# Altium project Studio_Clock_hv1.PrjPcb (part 1 of 3)
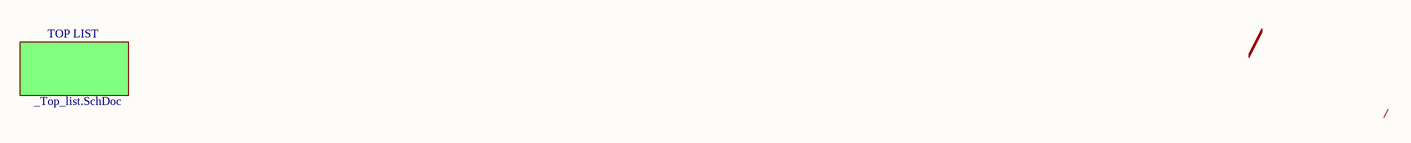
[diagram p0: Title.SchDoc]
PJ_Name: Studio Clock; PJ_Revision: V1.00
16 sheets, 343 parts. Net scope: flat (ports and power ports of the same name join across sheets).
Sheets:
  Title.SchDoc
    TOP LIST = _TOP_List.SchDoc
      Q_LIGHT_CTRL1 = Q_Light_CTRL1.SchDoc
      SWITCH = SWITCH_CTRL1.SchDoc
      MP_CTRL1 = MP_CTRL1.SchDoc
      CLOCK DISPLAY = CLOCK_Display.SchDoc
        AM_PM_INDICATOR = AM_PM_Indicator.SchDoc
        7 SEGMENT DISPLAY = Clock_7Segment.SchDoc
      VIDEO INTERFACE = VIDEO_Interface.SchDoc
      POE = POE.SchDoc
        POE_PSU = POE_PSU.SchDoc
        POE_PD1 = POE_PD.SchDoc
        PD_BUCK1 = PD Buck.SchDoc
      POWER SUPPLY = POWER_Supply.SchDoc
        BACKUP Power = BACKUP_Power.SchDoc
      RTC = RTC.SchDoc

## Sheet Title.SchDoc: =PJ_Name
size A4; SheetNumber: 1; SheetTotal: 16

### Sub-sheets
TOP LIST = _Top_list.SchDoc: no entries

### Notes on the sheet
- /

## Sheet _TOP_List.SchDoc: Studio Clock
size A4; Revision: V1.00; SheetNumber: 2; SheetTotal: 16
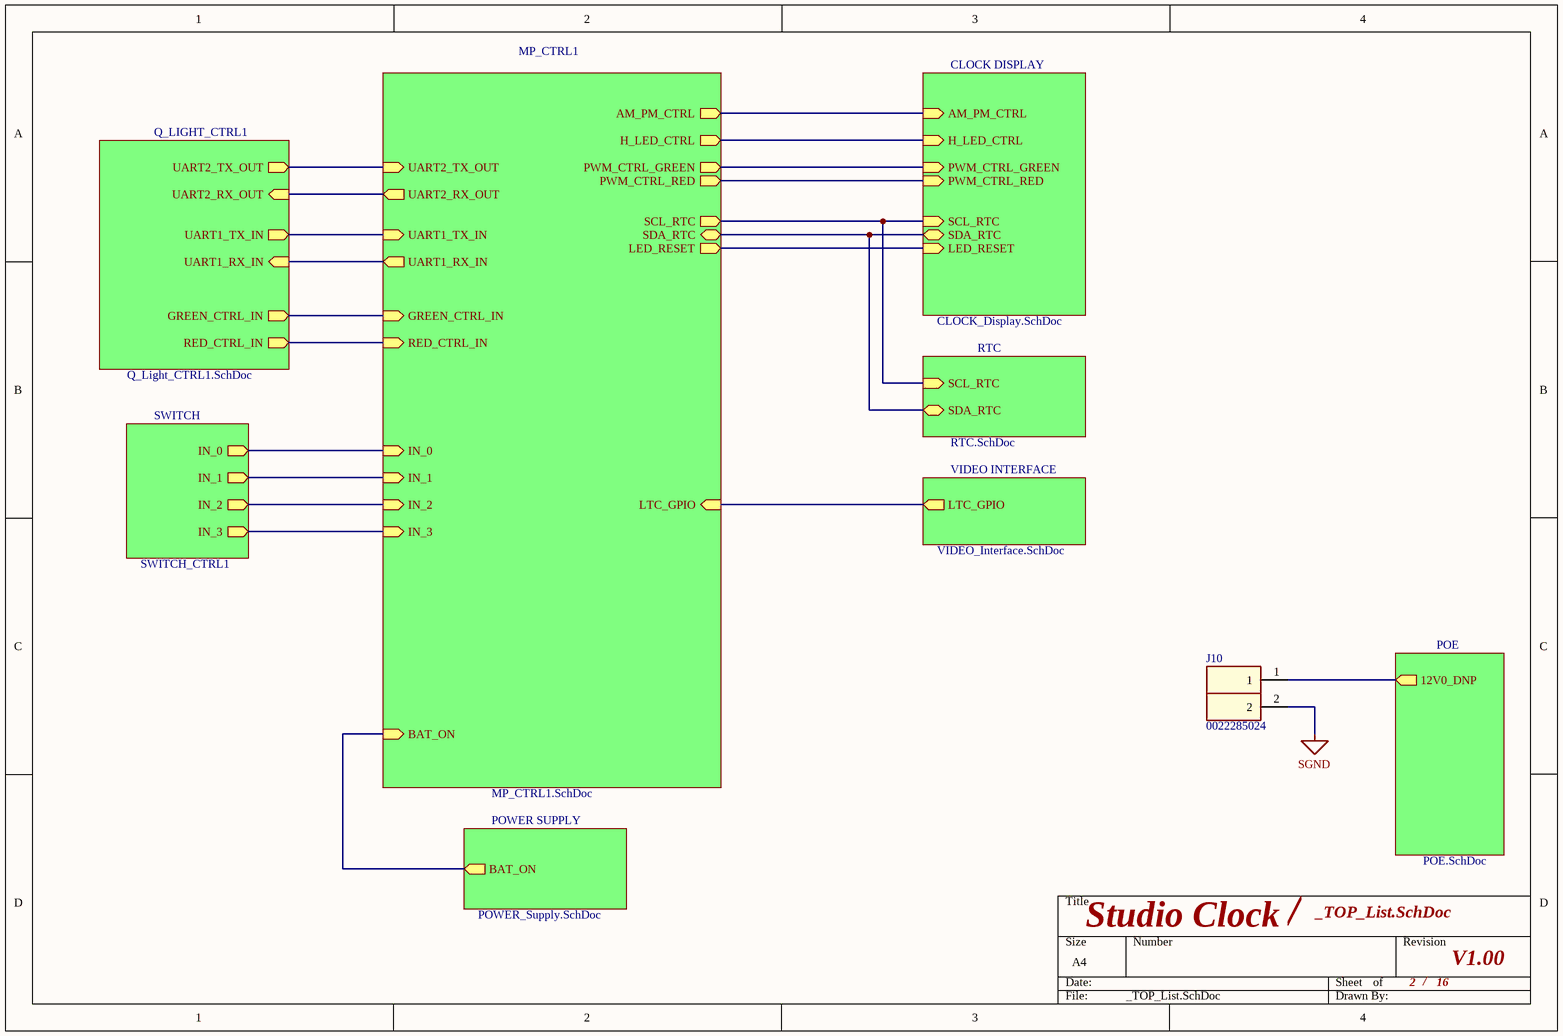
[diagram p1: _TOP_List.SchDoc]

### Parts
J10  0022285024  [PLS-02]

### Sub-sheets
CLOCK DISPLAY = CLOCK_Display.SchDoc: AM_PM_CTRL (in), H_LED_CTRL (in), PWM_CTRL_GREEN (in), PWM_CTRL_RED (in), SDA_RTC (bidir), SCL_RTC (in), LED_RESET (in)
MP_CTRL1 = MP_CTRL1.SchDoc: IN_0 (in), IN_1 (in), IN_2 (in), IN_3 (in), UART1_TX_IN (in), UART1_RX_IN (out), GREEN_CTRL_IN (in), RED_CTRL_IN (in), LTC_GPIO (in), AM_PM_CTRL (out), H_LED_CTRL (out), PWM_CTRL_GREEN (out), PWM_CTRL_RED (out), BAT_ON (in), SDA_RTC (bidir), SCL_RTC (out), LED_RESET (out), UART2_TX_OUT (in), UART2_RX_OUT (out)
POE = POE.SchDoc: 12V0_DNP (out)
POWER SUPPLY = POWER_Supply.SchDoc: BAT_ON (out)
Q_LIGHT_CTRL1 = Q_Light_CTRL1.SchDoc: UART1_TX_IN (out), UART1_RX_IN (in), GREEN_CTRL_IN (out), RED_CTRL_IN (out), UART2_TX_OUT (out), UART2_RX_OUT (in)
RTC = RTC.SchDoc: SDA_RTC (bidir), SCL_RTC (in)
SWITCH = SWITCH_CTRL1: IN_0 (out), IN_1 (out), IN_2 (out), IN_3 (out)
VIDEO INTERFACE = VIDEO_Interface.SchDoc: LTC_GPIO (out)

### Nets
SGND: J10.2
NetJ10_1: J10.1 ; sheet POE/12V0_DNP
(unnamed): sheet Q_LIGHT_CTRL1/UART1_TX_IN, sheet MP_CTRL1/UART1_TX_IN
(unnamed): sheet Q_LIGHT_CTRL1/UART1_RX_IN, sheet MP_CTRL1/UART1_RX_IN
(unnamed): sheet Q_LIGHT_CTRL1/GREEN_CTRL_IN, sheet MP_CTRL1/GREEN_CTRL_IN
(unnamed): sheet Q_LIGHT_CTRL1/RED_CTRL_IN, sheet MP_CTRL1/RED_CTRL_IN
(unnamed): sheet Q_LIGHT_CTRL1/UART2_TX_OUT, sheet MP_CTRL1/UART2_TX_OUT
(unnamed): sheet Q_LIGHT_CTRL1/UART2_RX_OUT, sheet MP_CTRL1/UART2_RX_OUT
(unnamed): sheet SWITCH/IN_0, sheet MP_CTRL1/IN_0
(unnamed): sheet SWITCH/IN_1, sheet MP_CTRL1/IN_1
(unnamed): sheet SWITCH/IN_2, sheet MP_CTRL1/IN_2
(unnamed): sheet SWITCH/IN_3, sheet MP_CTRL1/IN_3
(unnamed): sheet MP_CTRL1/LTC_GPIO, sheet VIDEO INTERFACE/LTC_GPIO
(unnamed): sheet MP_CTRL1/AM_PM_CTRL, sheet CLOCK DISPLAY/AM_PM_CTRL
(unnamed): sheet MP_CTRL1/H_LED_CTRL, sheet CLOCK DISPLAY/H_LED_CTRL
(unnamed): sheet MP_CTRL1/PWM_CTRL_GREEN, sheet CLOCK DISPLAY/PWM_CTRL_GREEN
(unnamed): sheet MP_CTRL1/PWM_CTRL_RED, sheet CLOCK DISPLAY/PWM_CTRL_RED
(unnamed): sheet MP_CTRL1/BAT_ON, sheet POWER SUPPLY/BAT_ON
(unnamed): sheet MP_CTRL1/SDA_RTC, sheet CLOCK DISPLAY/SDA_RTC, sheet RTC/SDA_RTC
(unnamed): sheet MP_CTRL1/SCL_RTC, sheet CLOCK DISPLAY/SCL_RTC, sheet RTC/SCL_RTC
(unnamed): sheet MP_CTRL1/LED_RESET, sheet CLOCK DISPLAY/LED_RESET

### Notes on the sheet
- /

### Library data of the parts
J10 = PLS_02: CONN HEADER VERT 2POS 2.54MM; MAnufacturer: MOLEX; MPN: 0022285024

## Sheet Q_Light_CTRL1.SchDoc
size A3; SheetNumber: 3; SheetTotal: 16
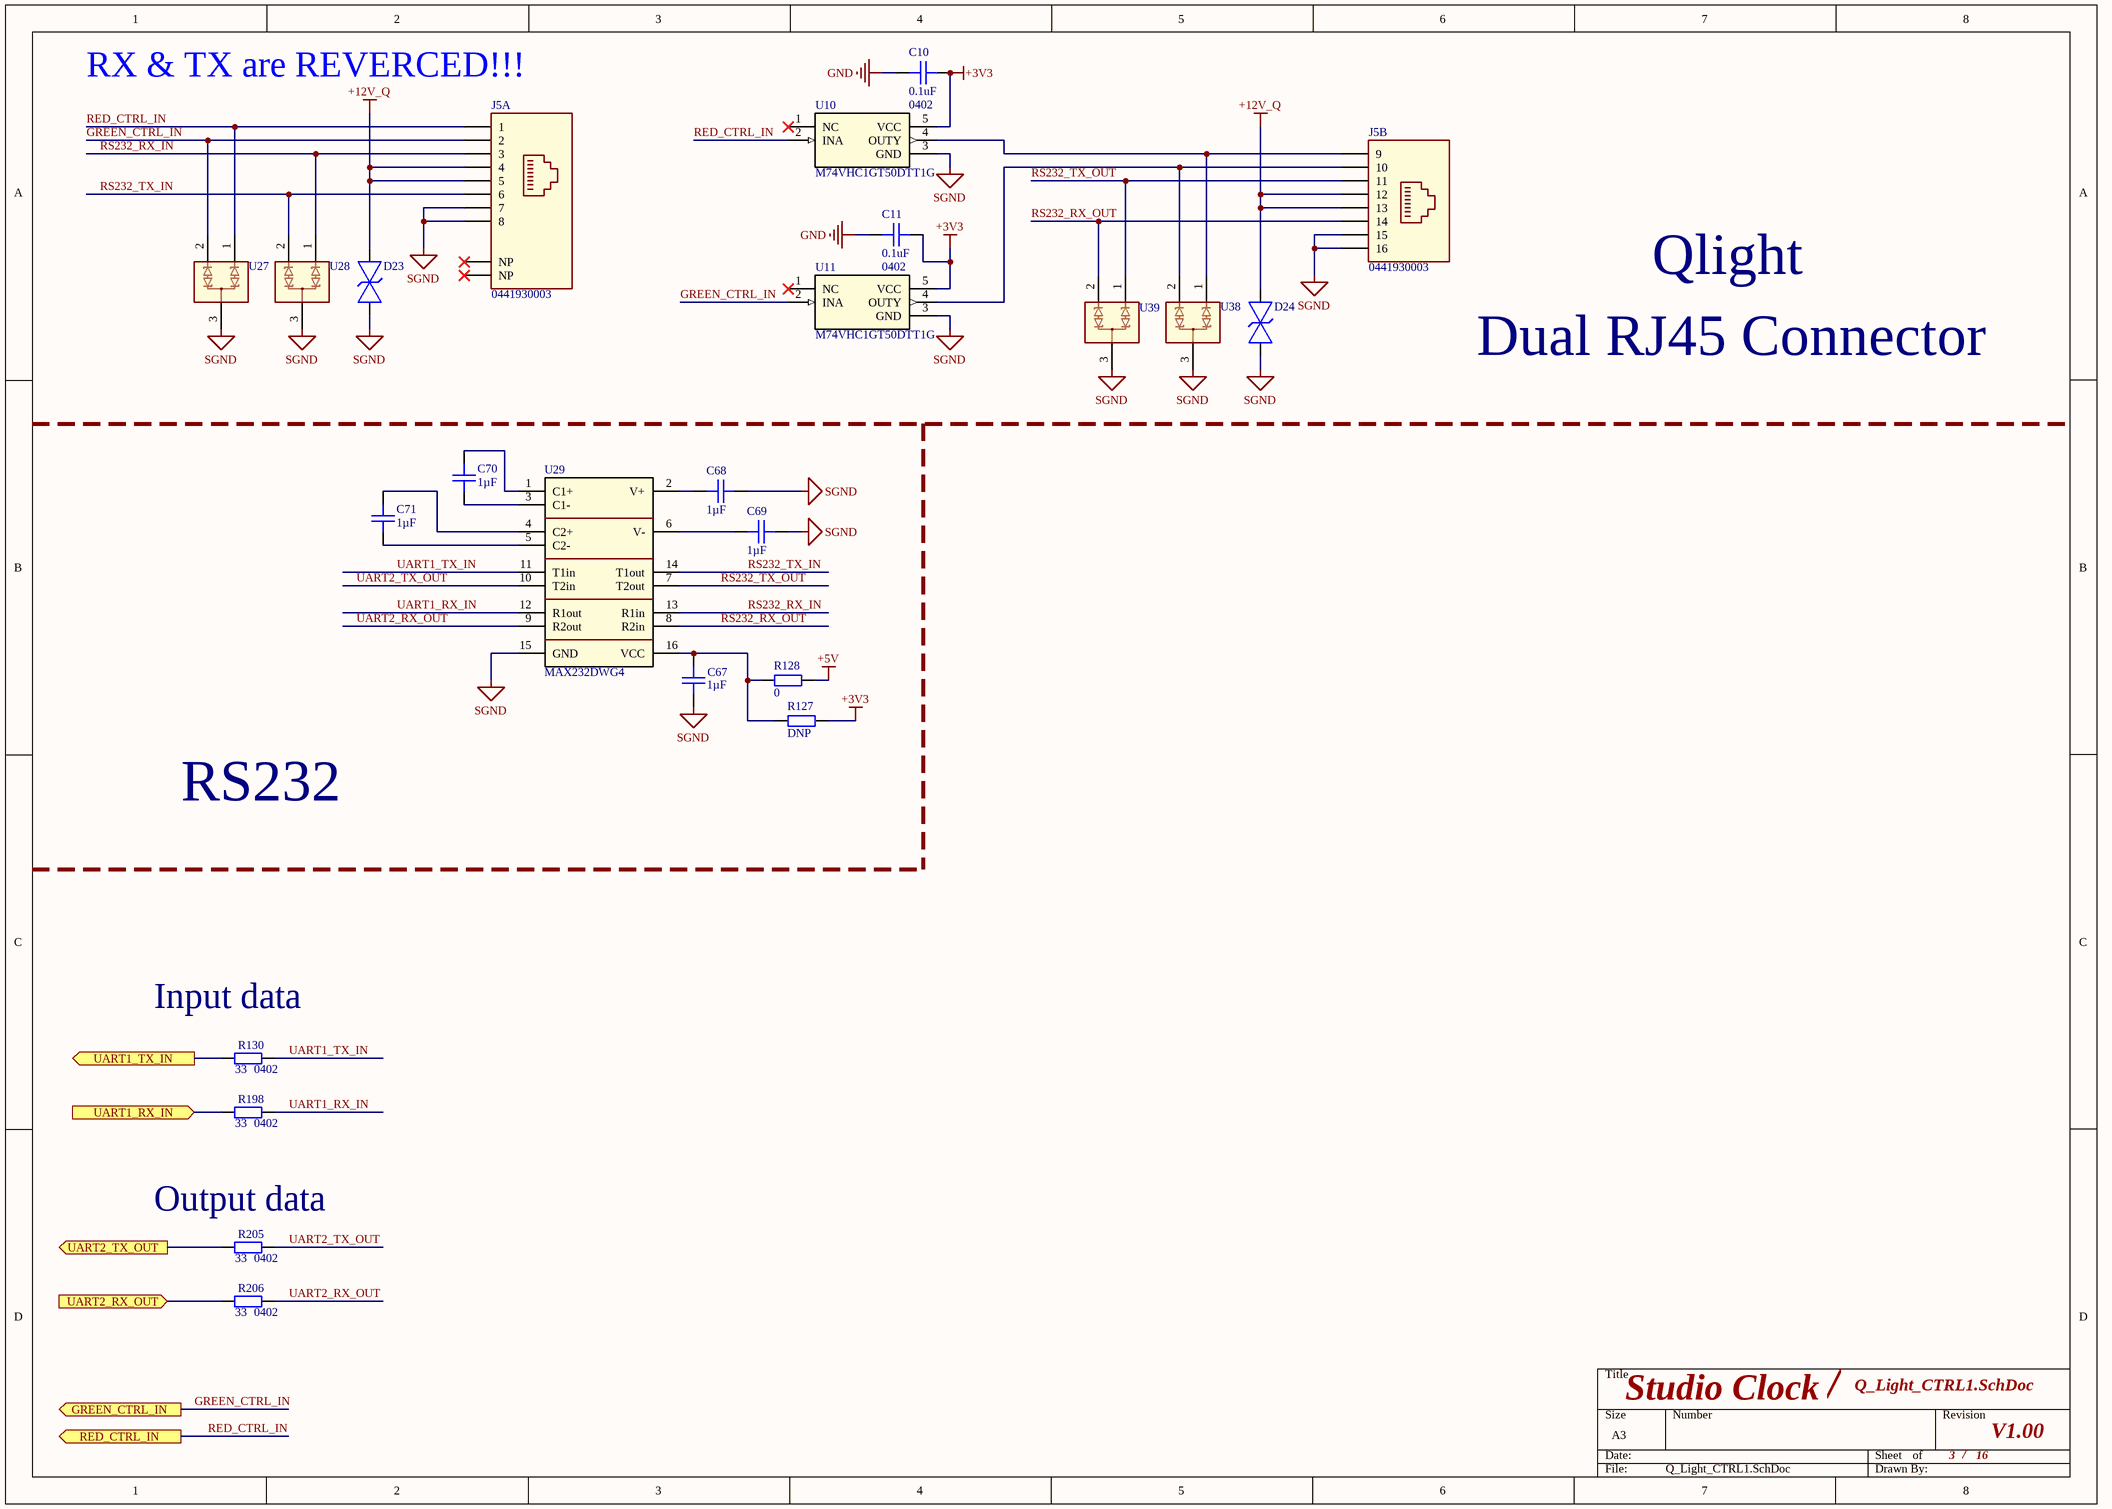
[diagram p2: Q_Light_CTRL1.SchDoc]

### Parts
C10  Capacitance: 0.1uF  Package1: 0402  [CAPC100x50x50L25]  (hidden comment: 04023C104KAT2A)
C11  Capacitance: 0.1uF  Package1: 0402  [CAPC100x50x50L25]  (hidden comment: 04023C104KAT2A)
C67  Capacitance: 1µF  [CAPC100x50x50L25]  (hidden comment: CC0402KPX5R7BB105)
C68  Capacitance: 1µF  [CAPC100x50x50L25]  (hidden comment: CC0402KPX5R7BB105)
C69  Capacitance: 1µF  [CAPC100x50x50L25]  (hidden comment: CC0402KPX5R7BB105)
C70  Capacitance: 1µF  [CAPC100x50x50L25]  (hidden comment: CC0402KPX5R7BB105)
C71  Capacitance: 1µF  [CAPC100x50x50L25]  (hidden comment: CC0402KPX5R7BB105)
D23  82356120100  [DIOM520X260X290XL115X145]  (value not drawn)
D24  82356120100  [DIOM520X260X290XL115X145]  (value not drawn)
J5  0441930003  [0441930003]  (parts A,B of 2)
R127  DNP  [RESC100X50X40L25]
R128  Resistance: 0  [RESC100X50X40L25]  (hidden comment: AC0402JR-070RL)
R130  Resistance: 33  Package2: 0402  [RESC100X50X40L25]  (hidden comment: RC0402FR-0733RL)
R198  Resistance: 33  Package2: 0402  [RESC100X50X40L25]  (hidden comment: RC0402FR-0733RL)
R205  Resistance: 33  Package2: 0402  [RESC100X50X40L25]  (hidden comment: RC0402FR-0733RL)
R206  Resistance: 33  Package2: 0402  [RESC100X50X40L25]  (hidden comment: RC0402FR-0733RL)
U10  M74VHC1GT50DTT1G  [SOP5P95_290X280X145L45X40]
U11  M74VHC1GT50DTT1G  [SOP5P95_290X280X145L45X40]
U27  PESD1CAN,215  [SOT23_PESD1_NEX]  (value not drawn)
U28  PESD1CAN,215  [SOT23_PESD1_NEX]  (value not drawn)
U29  MAX232DWG4  [DW16]
U38  PESD1CAN,215  [SOT23_PESD1_NEX]  (value not drawn)
U39  PESD1CAN,215  [SOT23_PESD1_NEX]  (value not drawn)

### Ports
GREEN_CTRL_IN (out), RED_CTRL_IN (out), UART1_RX_IN (in), UART1_TX_IN (out), UART2_RX_OUT (in), UART2_TX_OUT (out)

### Nets
+3V3: C10.1 C11.1 R127.2 U10.5(VCC) U11.5(VCC)
+5V: R128.2
+12V_Q: D23.1 D24.1 J5.4 J5.5 J5.12 J5.13
GND: C10.2 C11.2
SGND: C67.2 C68.1 C69.1 D23.2 D24.2 J5.7 J5.8 J5.15 J5.16 U10.3(GND) U11.3(GND) U27.3 U28.3 U29.15(GND) U38.3 U39.3
GREEN_CTRL_IN: J5.2 U11.2(INA) U27.2 ; port GREEN_CTRL_IN
RED_CTRL_IN: J5.1 U10.2(INA) U27.1 ; port RED_CTRL_IN
RS232_RX_IN: J5.3 U28.1 U29.13(R1in)
RS232_RX_OUT: J5.14 U29.8(R2in) U39.2
RS232_TX_IN: J5.6 U28.2 U29.14(T1out)
RS232_TX_OUT: J5.11 U29.7(T2out) U39.1
UART1_RX_IN: R198.1 U29.12(R1out)
UART1_RX_IN: R198.2 ; port UART1_RX_IN  [a separate net that carries the same name]
UART1_TX_IN: R130.1 U29.11(T1in)
UART1_TX_IN: R130.2 ; port UART1_TX_IN  [a separate net that carries the same name]
UART2_RX_OUT: R206.1 U29.9(R2out)
UART2_RX_OUT: R206.2 ; port UART2_RX_OUT  [a separate net that carries the same name]
UART2_TX_OUT: R205.1 U29.10(T2in)
UART2_TX_OUT: R205.2 ; port UART2_TX_OUT  [a separate net that carries the same name]
NetC67_1: C67.1 R127.1 R128.1 U29.16(VCC)
NetC68_2: C68.2 U29.2(V+)
NetC69_2: C69.2 U29.6(V-)
NetC70_1: C70.1 U29.1(C1+)
NetC70_2: C70.2 U29.3(C1-)
NetC71_1: C71.1 U29.4(C2+)
NetC71_2: C71.2 U29.5(C2-)
NetJ5_9: J5.9 U10.4(OUTY) U38.1
NetJ5_10: J5.10 U11.4(OUTY) U38.2

Not connected (* = marked no-connect by the designer): J5 17(NP)* 18(NP)*; U10 1(NC)*; U11 1(NC)*

### Notes on the sheet
- (near J5) RX & TX are REVERCED!!!
- Qlight
- Dual RJ45 Connector
- RS232
- (near R130) Input data
- (near R205) Output data
- /

### Library data of the parts
C10 C11 = CMP-001-0374-4: 0402 25V X7R 100 NF 10%; Manufacturer: KYOCERA AVX; Op Temp max: 85°C; Op Temp min: -55°C; ComponentLink3URL: https://www.digikey.com/en/products/detail/yageo/CC0402MRX5R5BB106/5195138; MPN: 04023C104KAT2A; ComponentLink1URL: https://www.yageo.com/upload/media/product/productsearch/datasheet/mlcc/UPY-GPHC_X5R_4V-to-50V_26.pdf; Package: 0402 (1005 Metric); Size: 1.00mm x 0.50mm; Height max: 700µm; Mounting Type: SM; Tolerance: 10%; ComponentLink1Description: Datasheet; ComponentLink3Description: Digikey; Ratings: -; Dielectric: X7R; ComponentLink2Description: Mouser; ComponentLink2URL: https://eu.mouser.com/ProductDetail/YAGEO/CC0402MRX5R5BB106?qs=zEY9bCHj09eCmUJdZuS5Lg%3D%3D; Lead Spacing: 0mm; Component Type: Ceramic Capacitor; Voltage Rating: 25V
C67-C71 = CMP-001-0374-4: CAP CER 1UF 16V X5R 0402; Manufacturer: YAGEO; Op Temp max: 85°C; Op Temp min: -55°C; Tolerance: 10%; MPN: CC0402KPX5R7BB105; ComponentLink1URL: https://www.yageo.com/upload/media/product/productsearch/datasheet/mlcc/UPY-GPHC_X5R_4V-to-50V_26.pdf; Package: 0402 (1005 Metric); Size: 1.00mm x 0.50mm; Height max: 700µm; Mounting Type: SM; ComponentLink1Description: Datasheet; Ratings: -; Dielectric: X5R; ComponentLink2Description: Mouser; Lead Spacing: 0mm; Component Type: Ceramic Capacitor; Voltage Rating: 16V
  C67-C69 C71: ComponentLink3URL: https://www.digikey.com/en/products/detail/yageo/CC0402MRX5R5BB106/5195138; ComponentLink3Description: Digikey; ComponentLink2URL: https://eu.mouser.com/ProductDetail/YAGEO/CC0402MRX5R5BB106?qs=zEY9bCHj09eCmUJdZuS5Lg%3D%3D
  C70: ComponentLink2URL: https://eu.mouser.com/ProductDetail/YAGEO/CC0402KPX5R7BB105?qs=W0yvOO0ixfFHgNkeru%2FKgA%3D%3D
D23 D24 = ESD_Diode 0603: TVS DEVICE 60V 0603; Manufacturer: Würth Elektronik; Working Voltage: 12 V; Capacitance: 10pF; Op Temp min: -45°C; Op Temp max: +85°C; Mounting Type: SM; ComponentLink3Description: Digikey; ComponentLink1Description: Datasheet; Diode Type: TVS; Voltage - DC max: 60V; ComponentLink1URL: https://www.we-online.com/components/products/datasheet/82356120100.pdf; Package: 0603; Height max: 0.9mm; ComponentLink3URL: https://www.digikey.com/en/products/detail/w%C3%BCrth-elektronik/82356120100/9817490; Size: 1.6mm x 0.8mm; MPN: 82356120100
J5 = 0441930003: CONN MOD JACK 8P8C R/A UNSHLD; MNF: Molex; Connector type: Jack (RJ45,Ethernet); Series: 44193; Mounting type: Surface Mount; Datasheet: https://www.molex.com/content/dam/molex/molex-dot-com/products/automated/en-us/salesdrawingpdf/441/44193/441930003_sd.pdf?inline; DigiKey: https://www.digikey.at/en/products/detail/molex/0441930003/2405005; MPN: 0441930003
R127 = CMP-001-0484-6: RES SMD 0 OHM JUMPER 1/16W 0402; Manufacturer: YAGEO; Power: 63mW; Op Temp min: -55°C; Temperature Coefficient: ±100ppm; Resistance: 0; Op Temp max: 155°C; ComponentLink3URL: https://www.digikey.com/en/products/detail/yageo/RC0402FR-0727RL/5280946; ComponentLink2Description: Mouser; Ratings: -; Tolerance: Jumper; Height max: 400µm; MPN: DNP; ComponentLink1URL: https://www.yageo.com/upload/media/product/productsearch/datasheet/rchip/PYu-RC_Group_51_RoHS_L_12.pdf; Size: 1.00mm x 0.50mm; Composition: Thick Film; Package: 0402 (1005 Metric); ComponentLink3Description: Digikey; Mounting Type: SM; ComponentLink2URL: https://eu.mouser.com/ProductDetail/YAGEO/RC0402FR-0727RL?qs=UOUeRUa%252B8Wlb37UyFHw9Bw%3D%3D; ComponentLink1Description: Datasheet; Component Type: Chip Resistor
R128 = CMP-001-0484-6: RES SMD 0 OHM JUMPER 1/16W 0402; Manufacturer: YAGEO; Power: 63mW; Op Temp min: -55°C; Temperature Coefficient: ±100ppm; Op Temp max: 155°C; ComponentLink3URL: https://www.digikey.com/en/products/detail/yageo/RC0402FR-0727RL/5280946; ComponentLink2Description: Mouser; Ratings: -; Tolerance: Jumper; Height max: 400µm; MPN: AC0402JR-070RL; ComponentLink1URL: https://www.yageo.com/upload/media/product/productsearch/datasheet/rchip/PYu-RC_Group_51_RoHS_L_12.pdf; Size: 1.00mm x 0.50mm; Composition: Thick Film; Package: 0402 (1005 Metric); ComponentLink3Description: Digikey; Mounting Type: SM; ComponentLink2URL: https://eu.mouser.com/ProductDetail/YAGEO/RC0402FR-0727RL?qs=UOUeRUa%252B8Wlb37UyFHw9Bw%3D%3D; ComponentLink1Description: Datasheet; Component Type: Chip Resistor
R130 R198 R205 R206 = CMP-001-0484-6: RES 33 OHM 1% 1/16W 0402; Manufacturer: YAGEO; Power: 63mW; Op Temp min: -55°C; Temperature Coefficient: ±100ppm; Op Temp max: 155°C; ComponentLink3URL: https://www.digikey.com/en/products/detail/yageo/RC0402FR-0727RL/5280946; ComponentLink2Description: Mouser; Ratings: -; Tolerance: 1%; Height max: 400µm; MPN: RC0402FR-0733RL; ComponentLink1URL: https://www.yageo.com/upload/media/product/productsearch/datasheet/rchip/PYu-RC_Group_51_RoHS_L_12.pdf; Size: 1.00mm x 0.50mm; Composition: Thick Film; Package: 0402 (1005 Metric); ComponentLink3Description: Digikey; Mounting Type: SM; ComponentLink2URL: https://eu.mouser.com/ProductDetail/YAGEO/RC0402FR-0727RL?qs=UOUeRUa%252B8Wlb37UyFHw9Bw%3D%3D; ComponentLink1Description: Datasheet; Component Type: Chip Resistor
U10 U11 = M74VHC1GT50DTT1G: IC BUFFER NON-INVERT 5.5V 5TSOP; Logic Type: Buffer, Non-Inverting; Manufacturer_Part_Number: M74VHC1GT50DTT1G; MPN: M74VHC1GT50DTT1G
U27 U28 U38 U39 = PESD1CAN,215: TVS DIODE 24VWM 70VC TO236AB; Mfr_Name: Nexperia; Voltage - Reverse Standoff (Typ): 24V; Current - Peak Pulse (10/1000µs): 3A (8/20µs); MPN: PESD1CAN,215; Type: DEV; ComponentLink1Description: DigiKey; ComponentLink1URL: https://www.digikey.at/en/products/detail/nexperia-usa-inc/pesd1can-215/1157428; ComponentLink2Description: Datasheet; ComponentLink2URL: https://assets.nexperia.com/documents/data-sheet/PESD1CAN.pdf
U29 = MAX232DWG4: IC TRANSCEIVER FULL 2/2 16SOIC; Mfr_Name: Texas Instruments; Copyright: Copyright (C) 2024 Ultra Librarian. All rights reserved.; MPN: MAX232DWG4; RefDes: RefDes; Type: DEV

## Sheet SWITCH_CTRL1.SchDoc
size A4; SheetNumber: 4; SheetTotal: 16
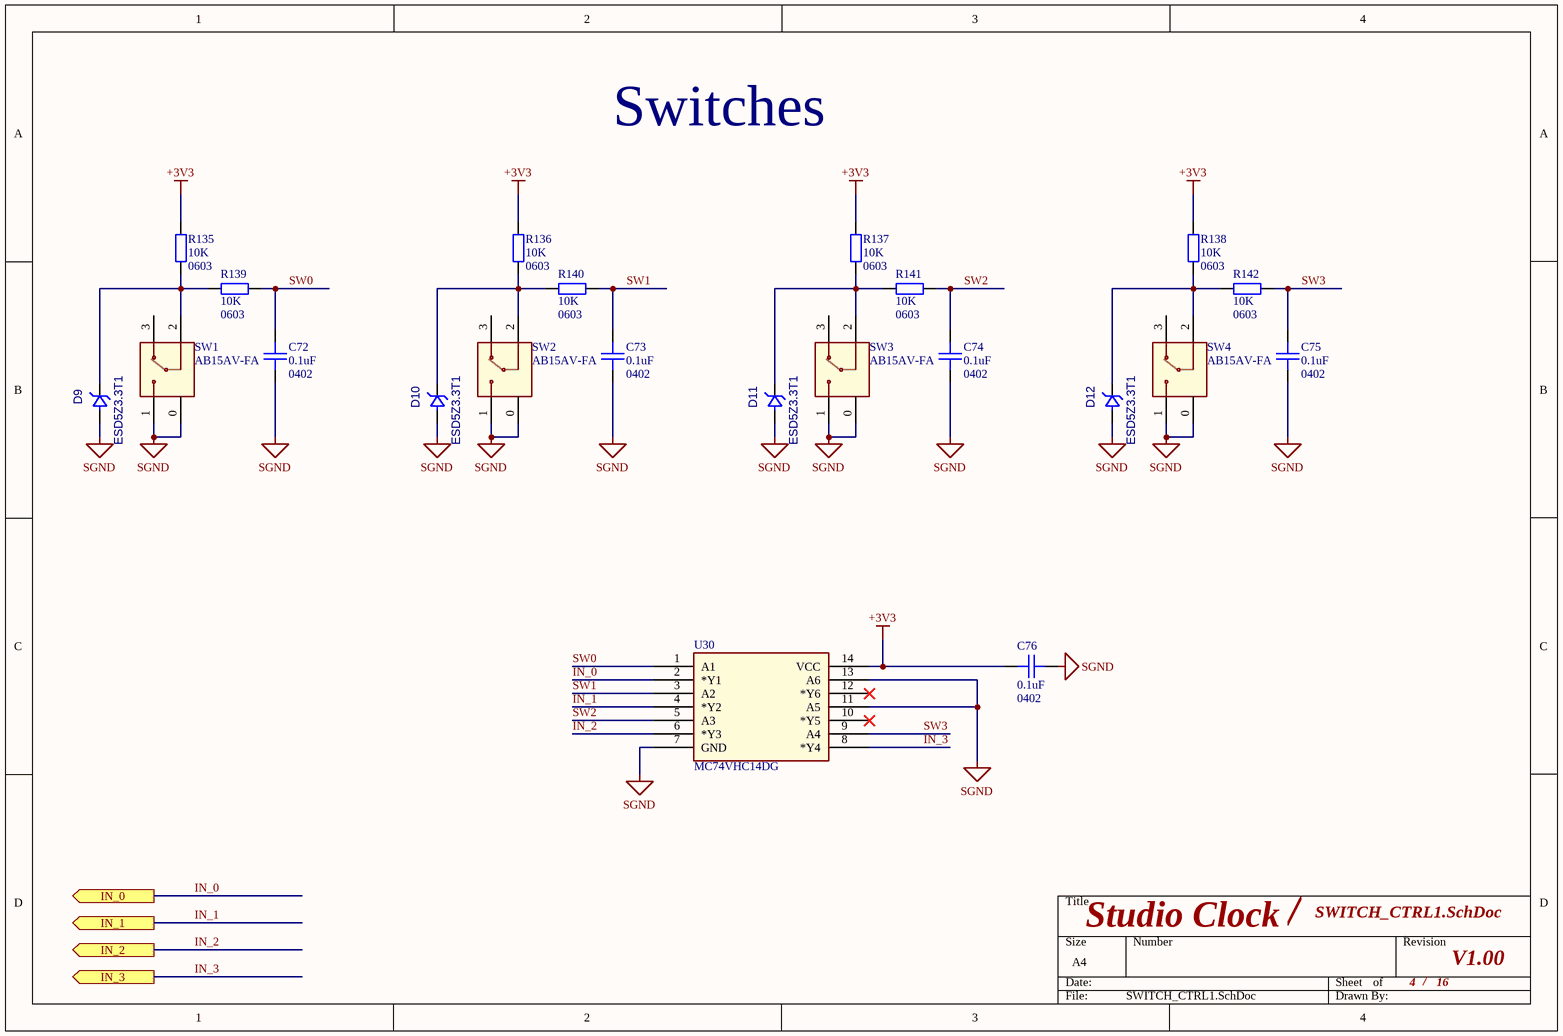
[diagram p3: SWITCH_CTRL1.SchDoc]

### Parts
C72  Capacitance: 0.1uF  Package1: 0402  [CAPC100x50x50L25]  (hidden comment: 04023C104KAT2A)
C73  Capacitance: 0.1uF  Package1: 0402  [CAPC100x50x50L25]  (hidden comment: 04023C104KAT2A)
C74  Capacitance: 0.1uF  Package1: 0402  [CAPC100x50x50L25]  (hidden comment: 04023C104KAT2A)
C75  Capacitance: 0.1uF  Package1: 0402  [CAPC100x50x50L25]  (hidden comment: 04023C104KAT2A)
C76  Capacitance: 0.1uF  Package1: 0402  [CAPC100x50x50L25]  (hidden comment: 04023C104KAT2A)
D9  ESD5Z3.3T1  [SOD-523]
D10  ESD5Z3.3T1  [SOD-523]
D11  ESD5Z3.3T1  [SOD-523]
D12  ESD5Z3.3T1  [SOD-523]
R135  Resistance: 10K  Size2: 0603  [RESC160X80X55L30]  (hidden comment: RC0603FR-0710KL)
R136  Resistance: 10K  Size2: 0603  [RESC160X80X55L30]  (hidden comment: RC0603FR-0710KL)
R137  Resistance: 10K  Size2: 0603  [RESC160X80X55L30]  (hidden comment: RC0603FR-0710KL)
R138  Resistance: 10K  Size2: 0603  [RESC160X80X55L30]  (hidden comment: RC0603FR-0710KL)
R139  Resistance: 10K  Size2: 0603  [RESC160X80X55L30]  (hidden comment: RC0603FR-0710KL)
R140  Resistance: 10K  Size2: 0603  [RESC160X80X55L30]  (hidden comment: RC0603FR-0710KL)
R141  Resistance: 10K  Size2: 0603  [RESC160X80X55L30]  (hidden comment: RC0603FR-0710KL)
R142  Resistance: 10K  Size2: 0603  [RESC160X80X55L30]  (hidden comment: RC0603FR-0710KL)
SW1  AB15AV-FA  [AB15AV-FA]
SW2  AB15AV-FA  [AB15AV-FA]
SW3  AB15AV-FA  [AB15AV-FA]
SW4  AB15AV-FA  [AB15AV-FA]
U30  MC74VHC14DG  [SOIC14P127_865X600X175L83X41]

### Ports
IN_0 (out), IN_1 (out), IN_2 (out), IN_3 (out)

### Nets
+3V3: C76.2 R135.2 R136.2 R137.2 R138.2 U30.14(VCC)
SGND: C72.1 C73.1 C74.1 C75.1 C76.1 D9.2(A) D10.2(A) D11.2(A) D12.2(A) SW1.0(SH) SW1.1 SW2.0(SH) SW2.1 SW3.0(SH) SW3.1 SW4.0(SH) SW4.1 U30.7(GND) U30.11(A5) U30.13(A6)
IN_0: U30.2(*Y1) ; port IN_0
IN_1: U30.4(*Y2) ; port IN_1
IN_2: U30.6(*Y3) ; port IN_2
IN_3: U30.8(*Y4) ; port IN_3
SW0: C72.2 R139.2 U30.1(A1)
SW1: C73.2 R140.2 U30.3(A2)
SW2: C74.2 R141.2 U30.5(A3)
SW3: C75.2 R142.2 U30.9(A4)
NetD9_1: D9.1(K) R135.1 R139.1 SW1.2
NetD10_1: D10.1(K) R136.1 R140.1 SW2.2
NetD11_1: D11.1(K) R137.1 R141.1 SW3.2
NetD12_1: D12.1(K) R138.1 R142.1 SW4.2

Not connected (* = marked no-connect by the designer): SW1 3; SW2 3; SW3 3; SW4 3; U30 10(*Y5)* 12(*Y6)*

### Notes on the sheet
- Switches
- /

### Library data of the parts
C72-C76 = CMP-001-0374-4: as C10 on sheet Q_Light_CTRL1; ComponentLink3URL: https://www.digikey.com/en/products/detail/yageo/CC0402MRX5R5BB106/5195138; MPN: 04023C104KAT2A; ComponentLink1URL: https://www.yageo.com/upload/media/product/productsearch/datasheet/mlcc/UPY-GPHC_X5R_4V-to-50V_26.pdf; Package: 0402 (1005 Metric); Size: 1.00mm x 0.50mm; Height max: 700µm; Mounting Type: SM; Tolerance: 10%; ComponentLink1Description: Datasheet; ComponentLink3Description: Digikey; Ratings: -; Dielectric: X7R; ComponentLink2Description: Mouser; ComponentLink2URL: https://eu.mouser.com/ProductDetail/YAGEO/CC0402MRX5R5BB106?qs=zEY9bCHj09eCmUJdZuS5Lg%3D%3D; Lead Spacing: 0mm; Component Type: Ceramic Capacitor; Voltage Rating: 25V
D9-D12 = ESD5Z3.3T1: TVS DIODE 3.3VWM 14.1VC SOD523; MPN: ESD5Z3.3T1G/T5G; Type: Zener; Voltage - Reverse Standoff (Typ): 3.3V (Max); Voltage - Breakdown (Min): 5V; Voltage - Clamping (Max) @ Ipp: 14.1V; Capacitance @ Frequency: 105pF @ 1MHz; Temperature MIN: -55°C; Temperature MAX: 150°C; Package: SC-79, SOD-523; ComponentLink1Description: Datasheet; ComponentLink1URL: https://www.onsemi.com/pdf/datasheet/esd5z2.5t1-d.pdf; ComponentLink2Description: DigiKey; ComponentLink2URL: https://www.digikey.com/en/products/detail/onsemi/esd5z3-3t1/1476606
R135-R142 = CMP-001-0628-7: RES 10K OHM 1% 1/10W 0603; Manufacturer: YAGEO; Power: 100mW; Temperature Coefficient: ±100ppm; Op Temp max: 155°C; Op Temp min: -55°C; PMNT: DNP; Ratings: -; ComponentLink3URL: https://www.digikey.com/en/products/detail/yageo/RC0603FR-0710KL/726880?s=N4IgTCBcDaIEoGEAMA2JBmAYnAtEg7AIxIDSAMiALoC%2BQA; Size: 1.60mm x 0.80mm; ComponentLink1Description: Datasheet; ComponentLink3Description: Digikey; ComponentLink2Description: Mouser; ComponentLink1URL: https://www.yageo.com/upload/media/product/products/datasheet/rchip/PYu-RC_51_RoHS_P_4.pdf; Composition: Thick Film; Package: 0603 (1608 Metric); ComponentLink2URL: https://eu.mouser.com/ProductDetail/YAGEO/RC0603FR-0710KL?qs=grNVn54RoB%252B3GtjbJj3wJQ%3D%3D; Mounting Type: SM; Tolerance: 1%; Height max: 550µm; MPN: RC0603FR-0710KL; Component Type: Chip Resistor
SW1-SW4 = AB15AV-FA: SWITCH PUSH SPDT 0.4VA 28V; Mfr_Name: NKK Switches; MPN: AB15AV-FA; Type: SPDT; Voltage: 28V; ComponentLink1Description: Datasheet; ComponentLink1URL: https://www.nkkswitches.com/pdf/Apushbuttons.pdf; ComponentLink2Description: DigiKey; ComponentLink2URL: https://www.digikey.ee/en/products/detail/nkk-switches/AB15AV-FA/1055811
U30 = MC74VHC14DG: IC INVERT SCHMITT 6CH 1IN 14SOIC; Mfr_Name: onsemi; Supply Voltage min: 2V; Supply Voltage max: 5.5V; Logic Type: Inverter; MPN: MC74VHC14DG; ComponentLink1Description: DigiKey; ComponentLink1URL: https://www.digikey.at/en/products/detail/onsemi/MC74VHC14DG/1480797?s=N4IgTCBcDaILIGEDsAWAagCQQRhQEQHEQBdAXyA; ComponentLink2Description: New link; ComponentLink2URL: https://www.onsemi.com/pdf/datasheet/mc74vhc14-d.pdf

## Sheet MP_CTRL1.SchDoc
size A3; SheetNumber: 5; SheetTotal: 16
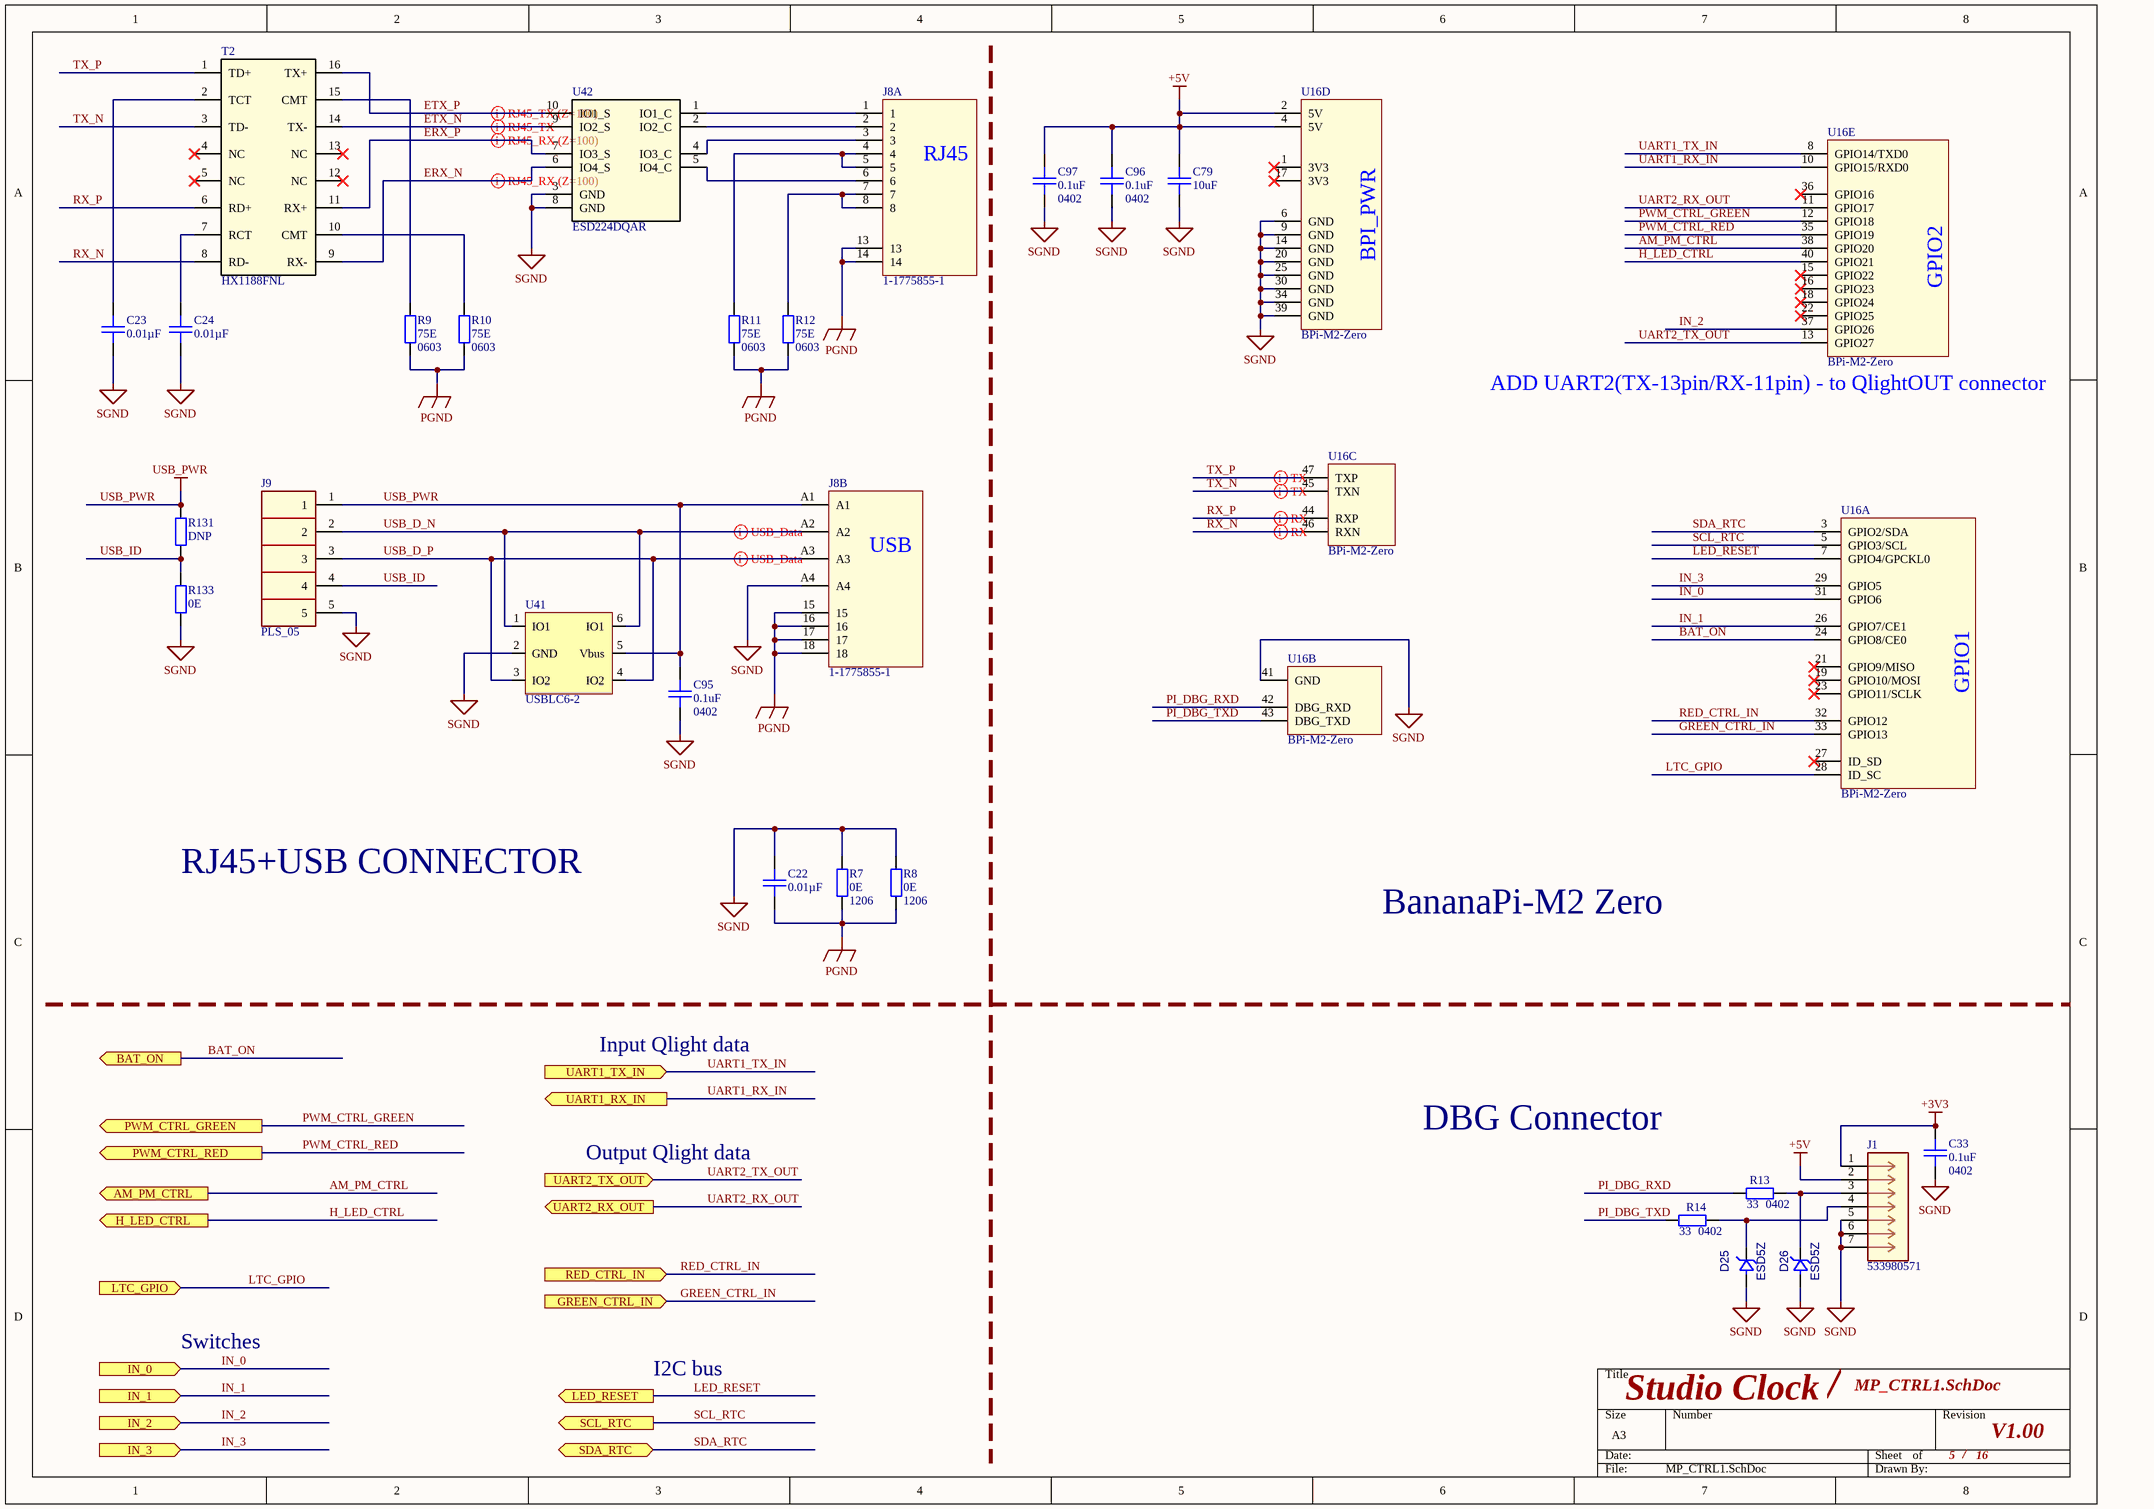
[diagram p4: MP_CTRL1.SchDoc]

### Parts
C22  Capacitance: 0.01µF  [CAPC340180_140N_KEM]  (hidden comment: C1206C103K2REC7800)
C23  Capacitance: 0.01µF  [CAPC340180_140N_KEM]  (hidden comment: C1206C103K2REC7800)
C24  Capacitance: 0.01µF  [CAPC340180_140N_KEM]  (hidden comment: C1206C103K2REC7800)
C33  Capacitance: 0.1uF  Package1: 0402  [CAPC100x50x50L25]  (hidden comment: 04023C104KAT2A)
C79  Capacitance: 10uF  [CAPC200X125X125L50]  (hidden comment: 0805W106K250CC)
C95  Capacitance: 0.1uF  Package1: 0402  [CAPC100x50x50L25]  (hidden comment: 04023C104KAT2A)
C96  Capacitance: 0.1uF  Package1: 0402  [CAPC100x50x50L25]  (hidden comment: 04023C104KAT2A)
C97  Capacitance: 0.1uF  Package1: 0402  [CAPC100x50x50L25]  (hidden comment: 04023C104KAT2A)
D25  ESD5Z  [SOD-523]
D26  ESD5Z  [SOD-523]
J1  533980571  [CON_533980571]
J8  1-1775855-1  [CONN12_1-1775855-1_TEC]  (parts A,B of 2)
J9  PLS_05  [PLS-05]
R7  Resistance: 0E  Size2: 1206  [RESC3116X06N]  (hidden comment: RC1206JR-070RL)
R8  Resistance: 0E  Size2: 1206  [RESC3116X06N]  (hidden comment: RC1206JR-070RL)
R9  Resistance: 75E  Size2: 0603  [RESC160X80X55L30]  (hidden comment: RC0603FR-0775RP)
R10  Resistance: 75E  Size2: 0603  [RESC160X80X55L30]  (hidden comment: RC0603FR-0775RP)
R11  Resistance: 75E  Size2: 0603  [RESC160X80X55L30]  (hidden comment: RC0603FR-0775RP)
R12  Resistance: 75E  Size2: 0603  [RESC160X80X55L30]  (hidden comment: RC0603FR-0775RP)
R13  Resistance: 33  Package2: 0402  [RESC100X50X40L25]  (hidden comment: RC0402FR-0733RL)
R14  Resistance: 33  Package2: 0402  [RESC100X50X40L25]  (hidden comment: RC0402FR-0733RL)
R131  DNP  [RESC100X50X40L25]
R133  Resistance: 0E  [RESC100X50X40L25]  (hidden comment: AC0402JR-070RL)
T2  HX1188FNL  [SOIC16_HX1188_PUL]
U16  BPi-M2-Zero  [BPi-M2-Zero]  (parts A,B,C,D,E of 5)
U41  USBLC6-2  [SOT23-6]
U42  ESD224DQAR  [DQA0010A]

### Ports
AM_PM_CTRL (out), BAT_ON (out), GREEN_CTRL_IN (in), H_LED_CTRL (out), IN_0 (in), IN_1 (in), IN_2 (in), IN_3 (in), LED_RESET (out), LTC_GPIO (in), PWM_CTRL_GREEN (out), PWM_CTRL_RED (out), RED_CTRL_IN (in), SCL_RTC (out), SDA_RTC (bidir), UART1_RX_IN (out), UART1_TX_IN (in), UART2_RX_OUT (out), UART2_TX_OUT (in)

### Nets
+3V3: C33.2 J1.1
+5V: C79.2 C96.2 C97.2 J1.2 U16.2(5V) U16.4(5V)
PGND: C22.1 J8.13 J8.14 J8.15 J8.16 J8.17 J8.18 R7.1 R8.1 R9.1 R10.1 R11.1 R12.1
SGND: C22.2 C23.1 C24.1 C33.1 C79.1 C95.1 C96.1 C97.1 D25.2(A) D26.2(A) J1.5 J1.6 J1.7 J8.A4 J9.5 R7.2 R8.2 R133.1 U16.6(GND) U16.9(GND) U16.14(GND) U16.20(GND) U16.25(GND) U16.30(GND) U16.34(GND) U16.39(GND) U16.41(GND) U41.2(GND) U42.3(GND) U42.8(GND)
USB_PWR: C95.2 J8.A1 J9.1 R131.2 U41.5(Vbus)
AM_PM_CTRL: U16.38(GPIO20) ; port AM_PM_CTRL
BAT_ON: U16.24(GPIO8/CE0) ; port BAT_ON
ERX_N: T2.9(RX-) U42.6(IO4_S)
ERX_P: T2.11(RX+) U42.7(IO3_S)
ETX_N: T2.14(TX-) U42.9(IO2_S)
ETX_P: T2.16(TX+) U42.10(IO1_S)
GREEN_CTRL_IN: U16.33(GPIO13) ; port GREEN_CTRL_IN
H_LED_CTRL: U16.40(GPIO21) ; port H_LED_CTRL
IN_0: U16.31(GPIO6) ; port IN_0
IN_1: U16.26(GPIO7/CE1) ; port IN_1
IN_2: U16.37(GPIO26) ; port IN_2
IN_3: U16.29(GPIO5) ; port IN_3
LED_RESET: U16.7(GPIO4/GPCKL0) ; port LED_RESET
LTC_GPIO: U16.28(ID_SC) ; port LTC_GPIO
PI_DBG_RXD: R13.2 U16.42(DBG_RXD)
PI_DBG_TXD: R14.2 U16.43(DBG_TXD)
PWM_CTRL_GREEN: U16.12(GPIO18) ; port PWM_CTRL_GREEN
PWM_CTRL_RED: U16.35(GPIO19) ; port PWM_CTRL_RED
RED_CTRL_IN: U16.32(GPIO12) ; port RED_CTRL_IN
RX_N: T2.8(RD-) U16.46(RXN)
RX_P: T2.6(RD+) U16.44(RXP)
SCL_RTC: U16.5(GPIO3/SCL) ; port SCL_RTC
SDA_RTC: U16.3(GPIO2/SDA) ; port SDA_RTC
TX_N: T2.3(TD-) U16.45(TXN)
TX_P: T2.1(TD+) U16.47(TXP)
UART1_RX_IN: U16.10(GPIO15/RXD0) ; port UART1_RX_IN
UART1_TX_IN: U16.8(GPIO14/TXD0) ; port UART1_TX_IN
UART2_RX_OUT: U16.11(GPIO17) ; port UART2_RX_OUT
UART2_TX_OUT: U16.13(GPIO27) ; port UART2_TX_OUT
USB_D_N: J8.A2 J9.2 U41.1(IO1) U41.6(IO1)
USB_D_P: J8.A3 J9.3 U41.3(IO2) U41.4(IO2)
USB_ID: J9.4 R131.1 R133.2
NetC23_2: C23.2 T2.2(TCT)
NetC24_2: C24.2 T2.7(RCT)
NetD25_1: D25.1(K) J1.4 R14.1
NetD26_1: D26.1(K) J1.3 R13.1
NetJ8_1: J8.1 U42.1(IO1_C)
NetJ8_2: J8.2 U42.2(IO2_C)
NetJ8_3: J8.3 U42.4(IO3_C)
NetJ8_4: J8.4 J8.5 R11.2
NetJ8_6: J8.6 U42.5(IO4_C)
NetJ8_7: J8.7 J8.8 R12.2
NetR9_2: R9.2 T2.15(CMT)
NetR10_2: R10.2 T2.10(CMT)

Not connected (* = marked no-connect by the designer): T2 4(NC)* 5(NC)* 12(NC)* 13(NC)*; U16 1(3V3)* 15(GPIO22)* 16(GPIO23)* 17(3V3)* 18(GPIO24)* 19(GPIO10/MOSI)* 21(GPIO9/MISO)* 22(GPIO25)* 23(GPIO11/SCLK)* 27(ID_SD)* 36(GPIO16)*

### Layout directives
differential pair: ERX_N, ERX_P, ETX_N, ETX_P, RX_N, RX_P, TX_N, TX_P, USB_D_N, USB_D_P

### Notes on the sheet
- (near U16) ADD UART2(TX-13pin/RX-11pin) - to QlightOUT connector
- RJ45+USB CONNECTOR
- BananaPi-M2 Zero
- Input Qlight data
- Output Qlight data
- DBG Connector
- Switches
- I2C bus
- /
- (in symbol 1-1775855-1, part A) RJ45
- (in symbol 1-1775855-1, part B) USB
- (in symbol BPi-M2-Zero, part A) GPIO1
- (in symbol BPi-M2-Zero, part D) BPI_PWR
- (in symbol BPi-M2-Zero, part E) GPIO2

### Library data of the parts
C22-C24 = CAP_1206: CAP CER 1206 10NF 200V X7R 10%; Manufacturer: YAGEO; Op Temp max: 85°C; Op Temp min: -55°C; ComponentLink3URL: https://www.digikey.com/en/products/detail/kemet/C1206C104K2REC7210/8645679; MPN: C1206C103K2REC7800; ComponentLink1URL: https://connect.kemet.com:7667/gateway/IntelliData-ComponentDocumentation/1.0/download/datasheet/C1206C104K2REC7210; Package: 1206 (3216 Metric); Size: 3.20mm x 1.60mm; Height max: 700µm; Mounting Type: SM; Tolerance: 10%; ComponentLink1Description: Datasheet; ComponentLink3Description: Digikey; Ratings: -; Dielectric: X7R; Lead Spacing: 0mm; Component Type: Ceramic Capacitor; Voltage Rating: 200V
C33 C95-C97 = CMP-001-0374-4: as C10 on sheet Q_Light_CTRL1; ComponentLink3URL: https://www.digikey.com/en/products/detail/yageo/CC0402MRX5R5BB106/5195138; MPN: 04023C104KAT2A; ComponentLink1URL: https://www.yageo.com/upload/media/product/productsearch/datasheet/mlcc/UPY-GPHC_X5R_4V-to-50V_26.pdf; Package: 0402 (1005 Metric); Size: 1.00mm x 0.50mm; Height max: 700µm; Mounting Type: SM; Tolerance: 10%; ComponentLink1Description: Datasheet; ComponentLink3Description: Digikey; Ratings: -; Dielectric: X7R; ComponentLink2Description: Mouser; ComponentLink2URL: https://eu.mouser.com/ProductDetail/YAGEO/CC0402MRX5R5BB106?qs=zEY9bCHj09eCmUJdZuS5Lg%3D%3D; Lead Spacing: 0mm; Component Type: Ceramic Capacitor; Voltage Rating: 25V
C79 = CMP-001-1415-2: CAP SMD 0805 X5R 10UF 10% 25V; Op Temp max: 125°C; Dielectric: X7R; Op Temp min: -55°C; Voltage Rating: 25V; ComponentLink1URL: https://mm.digikey.com/Volume0/opasdata/d220001/medias/docus/5660/3372_0805W106K250CC.pdf; ComponentLink3URL: https://www.digikey.com/en/products/detail/nextgen-components/0805W106K250CC/18676983; Mounting Type: SM; MPN: 0805W106K250CC; Package: 0805 (2012 Metric); ComponentLink3Description: Digikey; ComponentLink1Description: Datasheet; Tolerance: ±10%; Component Type: Ceramic Capacitor
D25 D26 = ESD5Z3.3T1: as D9 on sheet SWITCH_CTRL1; Temperature MIN: -55°C; Temperature MAX: 150°C; Package: SC-79, SOD-523; ComponentLink1Description: Datasheet; ComponentLink1URL: https://www.onsemi.com/pdf/datasheet/esd5z2.5t1-d.pdf; ComponentLink2Description: DigiKey; ComponentLink2URL: https://www.digikey.com/en/products/detail/onsemi/esd5z3-3t1/1476606
J1 = Con_533980571: CONN HEADER SMD 5POS 1.25MM; Mfr_Name: Molex Connector Corporation; Positions: 5; Manufacturer_Part_Number: 533980571; ComponentLink1Description: DigiKey; ComponentLink1URL: https://www.digikey.ee/en/products/detail/molex/0533980571/699069?s=N4IgTCBcDaIKwGYEE4AcAGOB2AjCAugL5A; ComponentLink2Description: MN; ComponentLink2URL: https://www.molex.com/en-us/products/part-detail/533980571; ComponentLink3Description: Datasheet; ComponentLink3URL: https://tools.molex.com/pdm_docs/sd/533980571_sd.pdf
J8 = 1-1775855-1: CONN MOD JACK 8P8C R/A SHIELDED; MFN: TE Connectivity; Type1: RefDes; Type: RJ45+USB -A; Copyright: Copyright (C) 2024 Ultra Librarian. All rights reserved.; MPN: 1-1775855-1
R7 R8 = RC_1206: RES 0 OHM JUMPER 1/4W 1206; MF: YAGEO; Power: 0.25W; Datasheet: https://www.yageo.com/upload/media/product/products/datasheet/rchip/PYu-RC_Group_51_RoHS_L_12.pdf; DigiKey: https://www.digikey.com/en/products/detail/yageo/RC1206JR-070RL/729184; Package: 1206 (3216 Metric); MPN: RC1206JR-070RL
R9-R12 = CMP-001-0628-7: RES 75 OHM 1% 1/10W 0603; Manufacturer: YAGEO; Power: 100mW; Temperature Coefficient: ±100ppm; Op Temp max: 155°C; Op Temp min: -55°C; PMNT: DNP; Ratings: -; ComponentLink3URL: https://www.digikey.com/en/products/detail/yageo/RC0603FR-0710KL/726880?s=N4IgTCBcDaIEoGEAMA2JBmAYnAtEg7AIxIDSAMiALoC%2BQA; Size: 1.60mm x 0.80mm; ComponentLink1Description: Datasheet; ComponentLink3Description: Digikey; ComponentLink2Description: Mouser; ComponentLink1URL: https://www.yageo.com/upload/media/product/products/datasheet/rchip/PYu-RC_51_RoHS_P_4.pdf; Composition: Thick Film; Package: 0603 (1608 Metric); ComponentLink2URL: https://eu.mouser.com/ProductDetail/YAGEO/RC0603FR-0710KL?qs=grNVn54RoB%252B3GtjbJj3wJQ%3D%3D; Mounting Type: SM; Tolerance: 1%; Height max: 550µm; MPN: RC0603FR-0775RP; Component Type: Chip Resistor
R13 R14 = CMP-001-0484-6: as R130 on sheet Q_Light_CTRL1; ComponentLink3URL: https://www.digikey.com/en/products/detail/yageo/RC0402FR-0727RL/5280946; ComponentLink2Description: Mouser; Ratings: -; Tolerance: 1%; Height max: 400µm; MPN: RC0402FR-0733RL; ComponentLink1URL: https://www.yageo.com/upload/media/product/productsearch/datasheet/rchip/PYu-RC_Group_51_RoHS_L_12.pdf; Size: 1.00mm x 0.50mm; Composition: Thick Film; Package: 0402 (1005 Metric); ComponentLink3Description: Digikey; Mounting Type: SM; ComponentLink2URL: https://eu.mouser.com/ProductDetail/YAGEO/RC0402FR-0727RL?qs=UOUeRUa%252B8Wlb37UyFHw9Bw%3D%3D; ComponentLink1Description: Datasheet; Component Type: Chip Resistor
R131 = CMP-001-0484-6: as R127 on sheet Q_Light_CTRL1; ComponentLink3URL: https://www.digikey.com/en/products/detail/yageo/RC0402FR-0727RL/5280946; ComponentLink2Description: Mouser; Ratings: -; Tolerance: Jumper; Height max: 400µm; MPN: DNP; ComponentLink1URL: https://www.yageo.com/upload/media/product/productsearch/datasheet/rchip/PYu-RC_Group_51_RoHS_L_12.pdf; Size: 1.00mm x 0.50mm; Composition: Thick Film; Package: 0402 (1005 Metric); ComponentLink3Description: Digikey; Mounting Type: SM; ComponentLink2URL: https://eu.mouser.com/ProductDetail/YAGEO/RC0402FR-0727RL?qs=UOUeRUa%252B8Wlb37UyFHw9Bw%3D%3D; ComponentLink1Description: Datasheet; Component Type: Chip Resistor
R133 = CMP-001-0484-6: as R128 on sheet Q_Light_CTRL1; ComponentLink3URL: https://www.digikey.com/en/products/detail/yageo/RC0402FR-0727RL/5280946; ComponentLink2Description: Mouser; Ratings: -; Tolerance: Jumper; Height max: 400µm; MPN: AC0402JR-070RL; ComponentLink1URL: https://www.yageo.com/upload/media/product/productsearch/datasheet/rchip/PYu-RC_Group_51_RoHS_L_12.pdf; Size: 1.00mm x 0.50mm; Composition: Thick Film; Package: 0402 (1005 Metric); ComponentLink3Description: Digikey; Mounting Type: SM; ComponentLink2URL: https://eu.mouser.com/ProductDetail/YAGEO/RC0402FR-0727RL?qs=UOUeRUa%252B8Wlb37UyFHw9Bw%3D%3D; ComponentLink1Description: Datasheet; Component Type: Chip Resistor
T2 = HX1188FNL: MODULE XFRMR SGL ETHR LAN 16SOIC; Mfr_Name: Pulse Electronics Corporation; Type: DEV; Copyright: Copyright (C) 2024 Ultra Librarian. All rights reserved.; MPN: HX1188FNL; RefDes: RefDes; ComponentLink1Description: DigiKey; ComponentLink1URL: https://www.digikey.com/en/products/detail/pulse-electronics/HX1188/754321
U16 = BPi-M2-Zero: Single board computer; ComponentLink1Description: Datasheet; ComponentLink1URL: https://wiki.banana-pi.org/Banana_Pi_BPI-M2_ZERO
U42 = ESD224DQAR: TVS DIODE 3.6VWM 14VC 10USON; Mfr_Name: Texas Instruments; Type: DEV; RefDes: RefDes; Copyright: Copyright (C) 2024 Ultra Librarian. All rights reserved.; MPN: ESD224DQAR; ComponentLink1Description: DigiKey; ComponentLink1URL: https://www.digikey.com/en/products/detail/texas-instruments/esd224dqar/8601783; ComponentLink2Description: Datashet; ComponentLink2URL: https://www.ti.com/general/docs/suppproductinfo.tsp?distId=10&gotoUrl=https%3A%2F%2Fwww.ti.com%2Flit%2Fgpn%2Fesd224

## Sheet CLOCK_Display.SchDoc
size A4; SheetNumber: 6; SheetTotal: 16
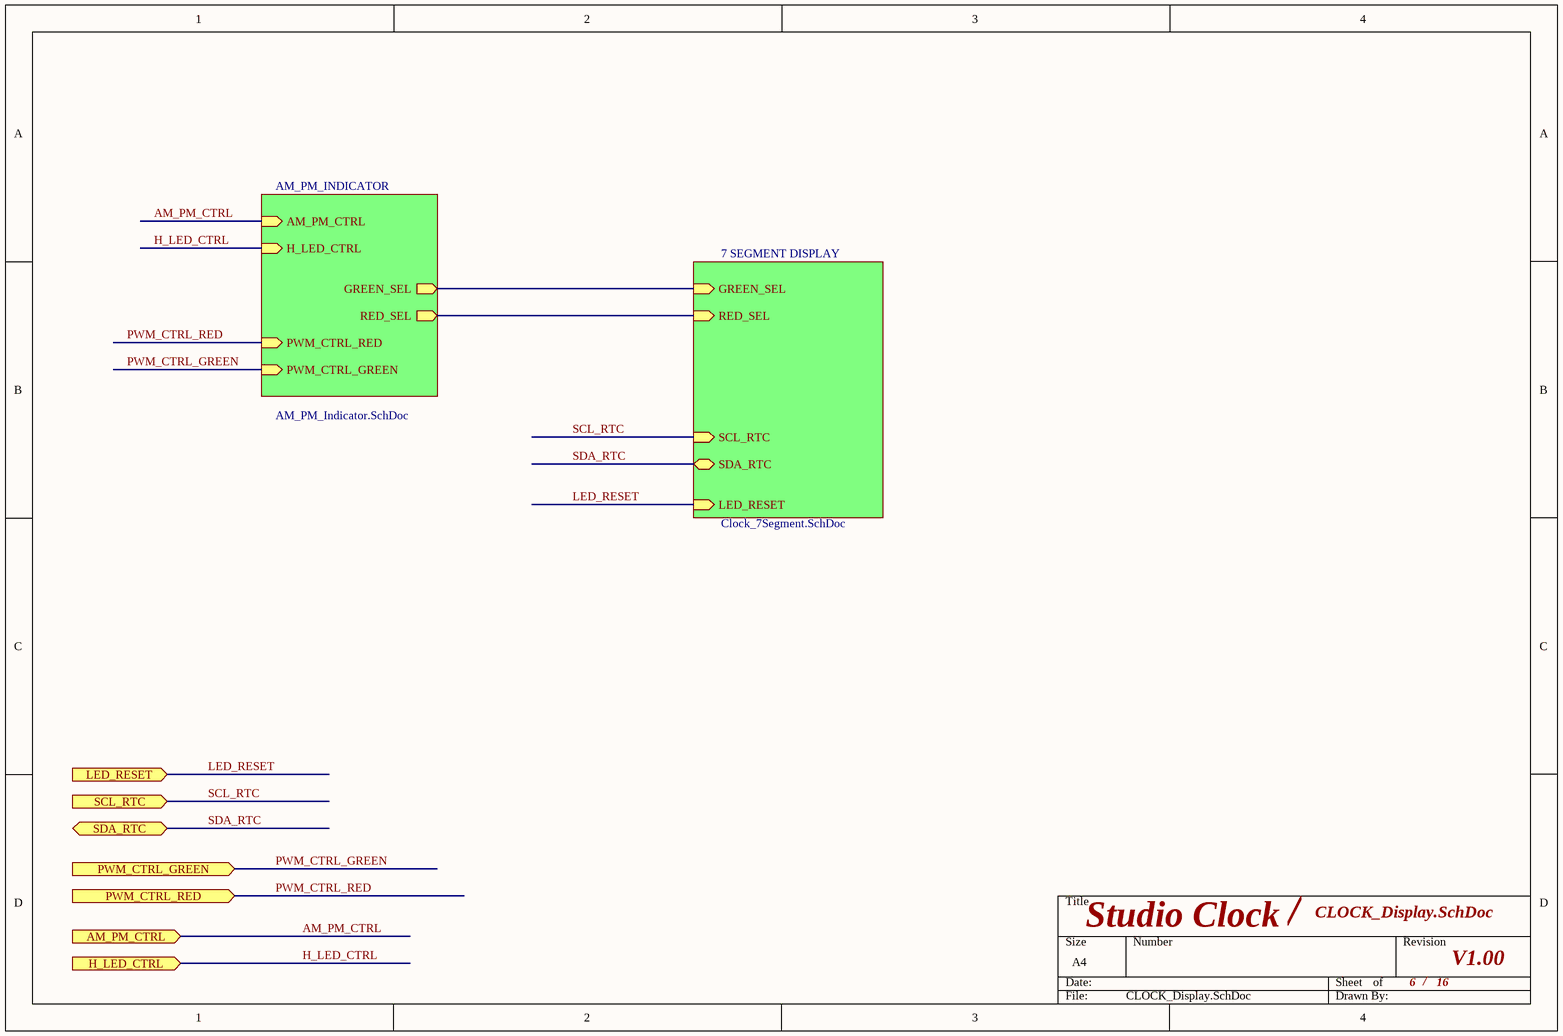
[diagram p5: CLOCK_Display.SchDoc]

### Sub-sheets
7 SEGMENT DISPLAY = Clock_7Segment.SchDoc: SCL_RTC (in), SDA_RTC (bidir), LED_RESET (in), GREEN_SEL (in), RED_SEL (in)
AM_PM_INDICATOR = AM_PM_Indicator.SchDoc: PWM_CTRL_RED (in), PWM_CTRL_GREEN (in), AM_PM_CTRL (in), H_LED_CTRL (in), RED_SEL (out), GREEN_SEL (out)

### Ports
AM_PM_CTRL (in), H_LED_CTRL (in), LED_RESET (in), PWM_CTRL_GREEN (in), PWM_CTRL_RED (in), SCL_RTC (in), SDA_RTC (bidir)

### Nets
AM_PM_CTRL: port AM_PM_CTRL, sheet AM_PM_INDICATOR/AM_PM_CTRL
H_LED_CTRL: port H_LED_CTRL, sheet AM_PM_INDICATOR/H_LED_CTRL
LED_RESET: port LED_RESET, sheet 7 SEGMENT DISPLAY/LED_RESET
PWM_CTRL_GREEN: port PWM_CTRL_GREEN, sheet AM_PM_INDICATOR/PWM_CTRL_GREEN
PWM_CTRL_RED: port PWM_CTRL_RED, sheet AM_PM_INDICATOR/PWM_CTRL_RED
SCL_RTC: port SCL_RTC, sheet 7 SEGMENT DISPLAY/SCL_RTC
SDA_RTC: port SDA_RTC, sheet 7 SEGMENT DISPLAY/SDA_RTC
(unnamed): sheet AM_PM_INDICATOR/RED_SEL, sheet 7 SEGMENT DISPLAY/RED_SEL
(unnamed): sheet AM_PM_INDICATOR/GREEN_SEL, sheet 7 SEGMENT DISPLAY/GREEN_SEL

### Notes on the sheet
- /

## Sheet AM_PM_Indicator.SchDoc
size A3; SheetNumber: 7; SheetTotal: 16
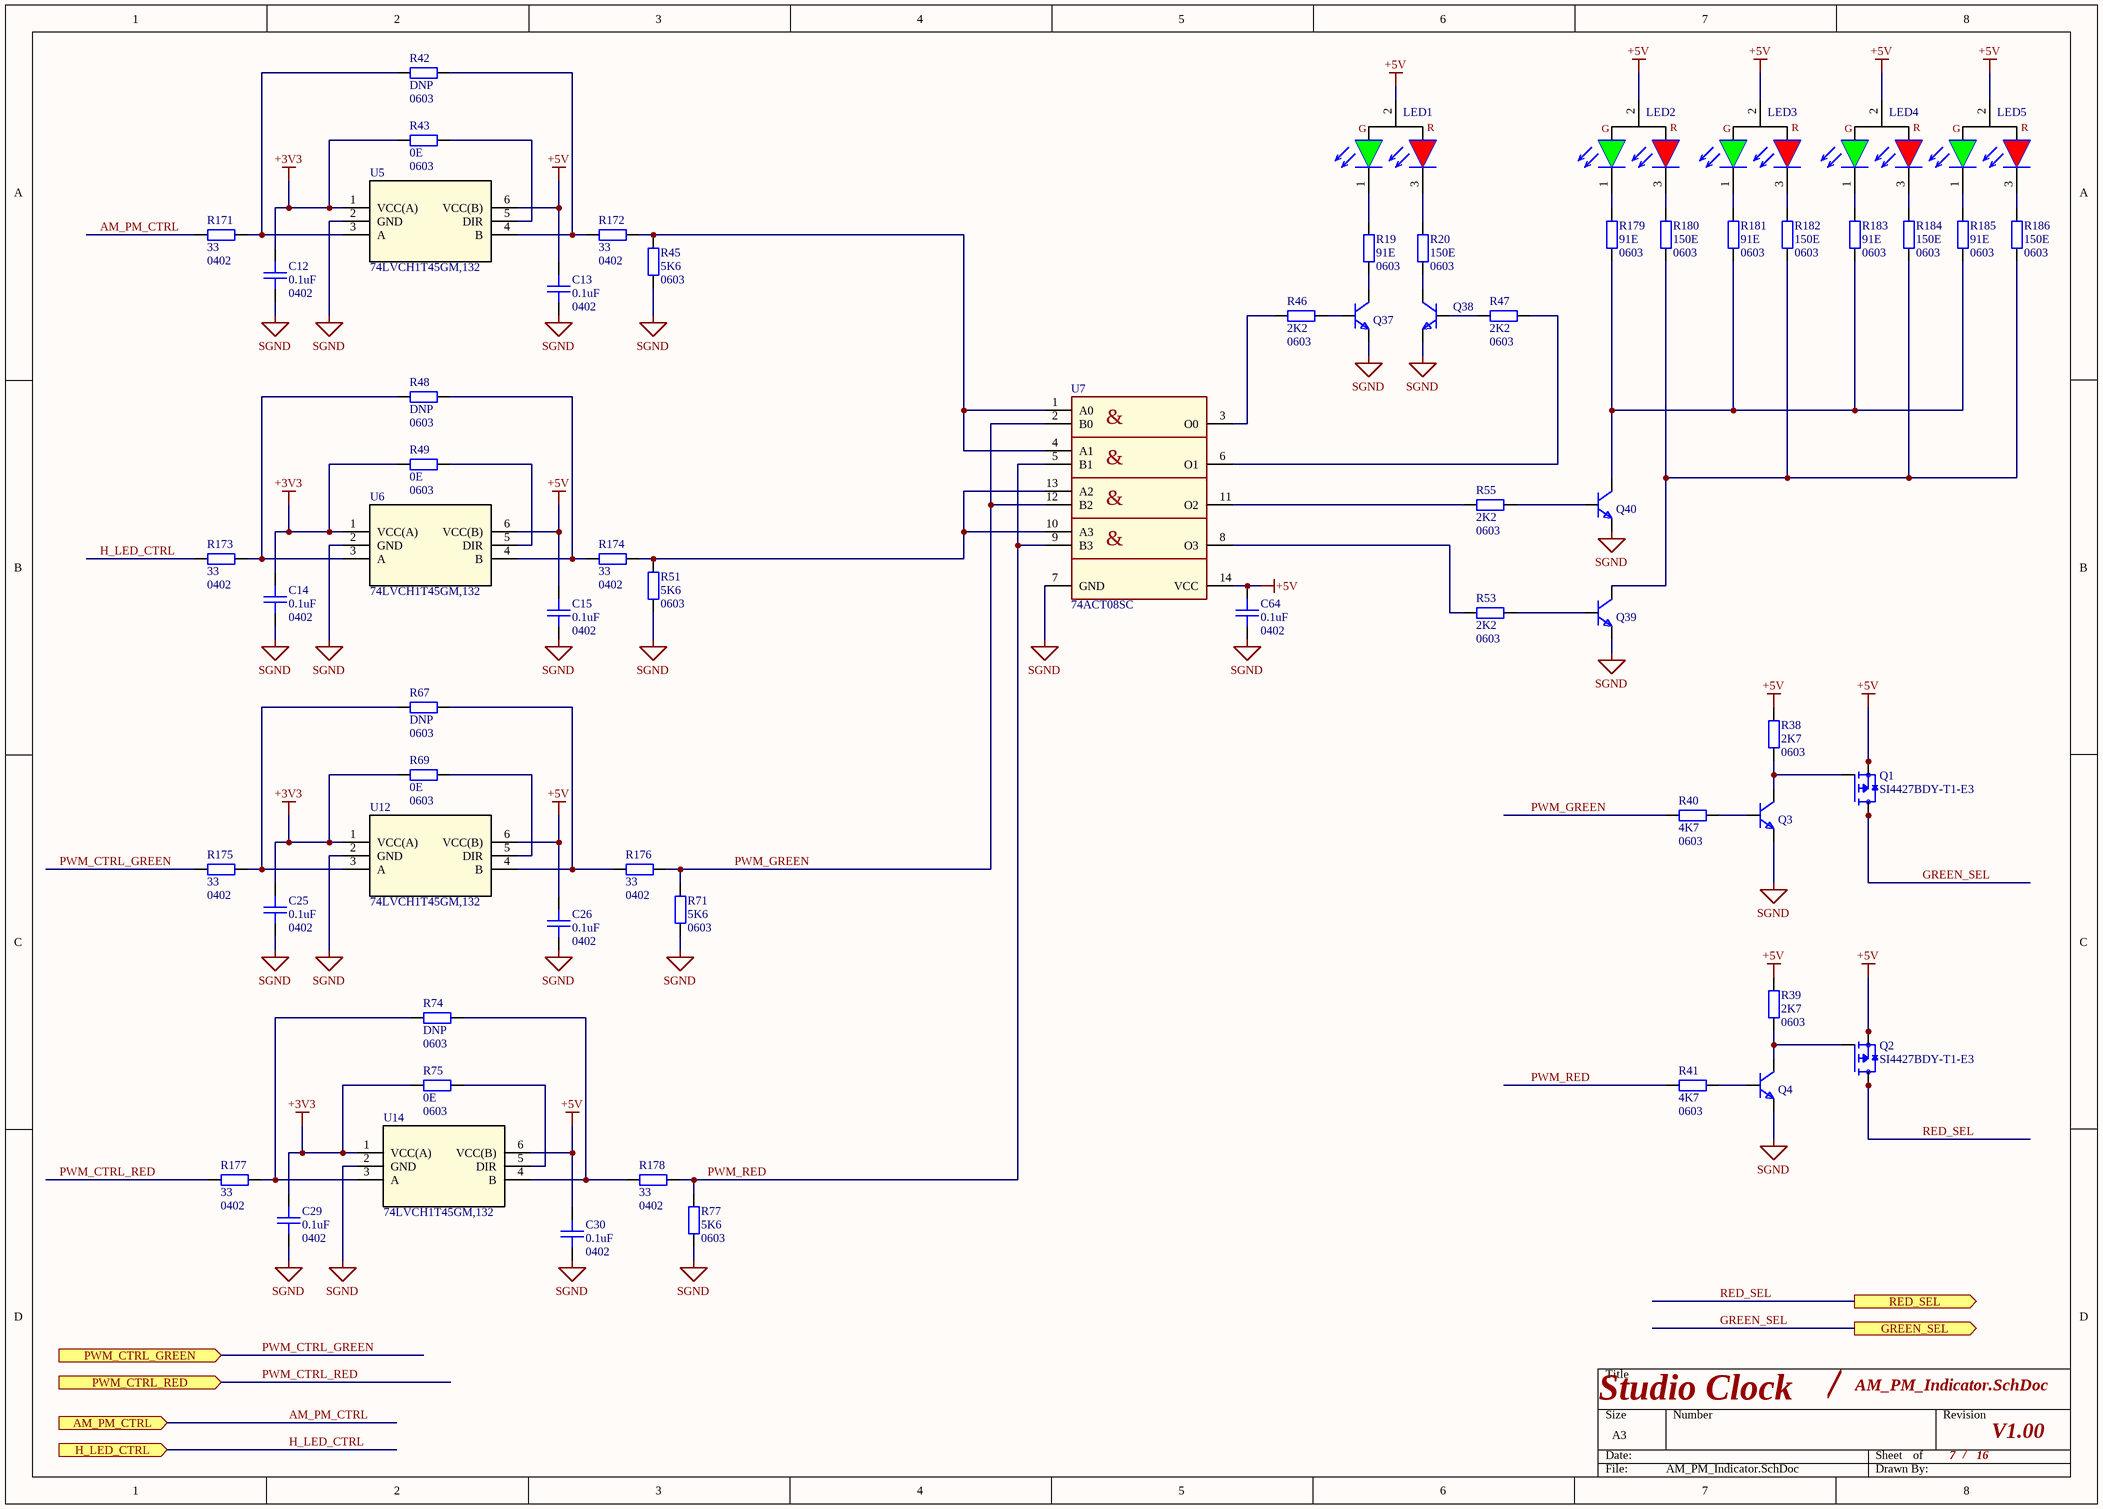
[diagram p6: AM_PM_Indicator.SchDoc]

### Parts
C12  Capacitance: 0.1uF  Package1: 0402  [CAPC100x50x50L25]  (hidden comment: 04023C104KAT2A)
C13  Capacitance: 0.1uF  Package1: 0402  [CAPC100x50x50L25]  (hidden comment: 04023C104KAT2A)
C14  Capacitance: 0.1uF  Package1: 0402  [CAPC100x50x50L25]  (hidden comment: 04023C104KAT2A)
C15  Capacitance: 0.1uF  Package1: 0402  [CAPC100x50x50L25]  (hidden comment: 04023C104KAT2A)
C25  Capacitance: 0.1uF  Package1: 0402  [CAPC100x50x50L25]  (hidden comment: 04023C104KAT2A)
C26  Capacitance: 0.1uF  Package1: 0402  [CAPC100x50x50L25]  (hidden comment: 04023C104KAT2A)
C29  Capacitance: 0.1uF  Package1: 0402  [CAPC100x50x50L25]  (hidden comment: 04023C104KAT2A)
C30  Capacitance: 0.1uF  Package1: 0402  [CAPC100x50x50L25]  (hidden comment: 04023C104KAT2A)
C64  Capacitance: 0.1uF  Package1: 0402  [CAPC100x50x50L25]  (hidden comment: 04023C104KAT2A)
LED1  484759  [LED_3mm_bicolor]  (value not drawn)
LED2  484759  [LED_3mm_bicolor]  (value not drawn)
LED3  484759  [LED_3mm_bicolor]  (value not drawn)
LED4  484759  [LED_3mm_bicolor]  (value not drawn)
LED5  484759  [LED_3mm_bicolor]  (value not drawn)
Q1  SI4427BDY-T1-E3  [SOIC8_127P600X175-8N]
Q2  SI4427BDY-T1-E3  [SOIC8_127P600X175-8N]
Q3  MMBT3904-TP  [SOT-23_MCC]  (value not drawn)
Q4  MMBT3904-TP  [SOT-23_MCC]  (value not drawn)
Q37  MMBT3904-TP  [SOT-23_MCC]  (value not drawn)
Q38  MMBT3904-TP  [SOT-23_MCC]  (value not drawn)
Q39  MMBT3904-TP  [SOT-23_MCC]  (value not drawn)
Q40  MMBT3904-TP  [SOT-23_MCC]  (value not drawn)
R19  Resistance: 91E  Size2: 0603  [RESC160X80X55L30]  (hidden comment: RC0603JR-0791RL)
R20  Resistance: 150E  Size2: 0603  [RESC160X80X55L30]  (hidden comment: RC0603JR-07150RL)
R38  Resistance: 2K7  Size2: 0603  [RESC160X80X55L30]  (hidden comment: RC0603FR-072K7L)
R39  Resistance: 2K7  Size2: 0603  [RESC160X80X55L30]  (hidden comment: RC0603FR-072K7L)
R40  Resistance: 4K7  Size2: 0603  [RESC160X80X55L30]  (hidden comment: RC0603FR-074K7L)
R41  Resistance: 4K7  Size2: 0603  [RESC160X80X55L30]  (hidden comment: RC0603FR-074K7L)
R42  Size2: 0603  [RESC160X80X55L30]  (hidden comment: DNP)
R43  Resistance: 0E  Size2: 0603  [RESC160X80X55L30]  (hidden comment: RC0603JR-070RL)
R45  Resistance: 5K6  Size2: 0603  [RESC160X80X55L30]  (hidden comment: CRCW06035K60JNEA)
R46  Resistance: 2K2  Size2: 0603  [RESC160X80X55L30]  (hidden comment: RC0603FR-072K2L)
R47  Resistance: 2K2  Size2: 0603  [RESC160X80X55L30]  (hidden comment: RC0603FR-072K2L)
R48  Size2: 0603  [RESC160X80X55L30]  (hidden comment: DNP)
R49  Resistance: 0E  Size2: 0603  [RESC160X80X55L30]  (hidden comment: RC0603JR-070RL)
R51  Resistance: 5K6  Size2: 0603  [RESC160X80X55L30]  (hidden comment: CRCW06035K60JNEA)
R53  Resistance: 2K2  Size2: 0603  [RESC160X80X55L30]  (hidden comment: RC0603FR-072K2L)
R55  Resistance: 2K2  Size2: 0603  [RESC160X80X55L30]  (hidden comment: RC0603FR-072K2L)
R67  Resistance: DNP  Size2: 0603  [RESC160X80X55L30]  (hidden comment: RC0603JR-070RL)
R69  Resistance: 0E  Size2: 0603  [RESC160X80X55L30]  (hidden comment: RC0603JR-070RL)
R71  Resistance: 5K6  Size2: 0603  [RESC160X80X55L30]  (hidden comment: CRCW06035K60JNEA)
R74  Size2: 0603  [RESC160X80X55L30]  (hidden comment: DNP)
R75  Resistance: 0E  Size2: 0603  [RESC160X80X55L30]  (hidden comment: RC0603JR-070RL)
R77  Resistance: 5K6  Size2: 0603  [RESC160X80X55L30]  (hidden comment: CRCW06035K60JNEA)
R171  Resistance: 33  Package2: 0402  [RESC100X50X40L25]  (hidden comment: RC0402FR-0733RL)
R172  Resistance: 33  Package2: 0402  [RESC100X50X40L25]  (hidden comment: RC0402FR-0733RL)
R173  Resistance: 33  Package2: 0402  [RESC100X50X40L25]  (hidden comment: RC0402FR-0733RL)
R174  Resistance: 33  Package2: 0402  [RESC100X50X40L25]  (hidden comment: RC0402FR-0733RL)
R175  Resistance: 33  Package2: 0402  [RESC100X50X40L25]  (hidden comment: RC0402FR-0733RL)
R176  Resistance: 33  Package2: 0402  [RESC100X50X40L25]  (hidden comment: RC0402FR-0733RL)
R177  Resistance: 33  Package2: 0402  [RESC100X50X40L25]  (hidden comment: RC0402FR-0733RL)
R178  Resistance: 33  Package2: 0402  [RESC100X50X40L25]  (hidden comment: RC0402FR-0733RL)
R179  Resistance: 91E  Size2: 0603  [RESC160X80X55L30]  (hidden comment: RC0603JR-0791RL)
R180  Resistance: 150E  Size2: 0603  [RESC160X80X55L30]  (hidden comment: RC0603JR-07150RL)
R181  Resistance: 91E  Size2: 0603  [RESC160X80X55L30]  (hidden comment: RC0603JR-0791RL)
R182  Resistance: 150E  Size2: 0603  [RESC160X80X55L30]  (hidden comment: RC0603JR-07150RL)
R183  Resistance: 91E  Size2: 0603  [RESC160X80X55L30]  (hidden comment: RC0603JR-0791RL)
R184  Resistance: 150E  Size2: 0603  [RESC160X80X55L30]  (hidden comment: RC0603JR-07150RL)
R185  Resistance: 91E  Size2: 0603  [RESC160X80X55L30]  (hidden comment: RC0603JR-0791RL)
R186  Resistance: 150E  Size2: 0603  [RESC160X80X55L30]  (hidden comment: RC0603JR-07150RL)
U5  74LVCH1T45GM,132  [74LVCH1T45_XSON6_NEX]
U6  74LVCH1T45GM,132  [74LVCH1T45_XSON6_NEX]
U7  74ACT08SC  [SOIC14P127_865X600X175L83X41]
U12  74LVCH1T45GM,132  [74LVCH1T45_XSON6_NEX]
U14  74LVCH1T45GM,132  [74LVCH1T45_XSON6_NEX]

### Ports
AM_PM_CTRL (in), GREEN_SEL (out), H_LED_CTRL (in), PWM_CTRL_GREEN (in), PWM_CTRL_RED (in), RED_SEL (out)

### Nets
+3V3: C12.2 C14.2 C25.2 C29.2 R43.2 R49.2 R69.2 R75.2 U5.1(VCC(A)) U6.1(VCC(A)) U12.1(VCC(A)) U14.1(VCC(A))
+5V: C13.2 C15.2 C26.2 C30.2 C64.2 LED1.2(A) LED2.2(A) LED3.2(A) LED4.2(A) LED5.2(A) Q1.1(S) Q1.2(S) Q1.3(S) Q2.1(S) Q2.2(S) Q2.3(S) R38.2 R39.2 U5.6(VCC(B)) U6.6(VCC(B)) U7.14(VCC) U12.6(VCC(B)) U14.6(VCC(B))
SGND: C12.1 C13.1 C14.1 C15.1 C25.1 C26.1 C29.1 C30.1 C64.1 Q3.2(E) Q4.2(E) Q37.2(E) Q38.2(E) Q39.2(E) Q40.2(E) R45.1 R51.1 R71.1 R77.1 U5.2(GND) U6.2(GND) U7.7(GND) U12.2(GND) U14.2(GND)
AM_PM_CTRL: R171.2 ; port AM_PM_CTRL
GREEN_SEL: Q1.5(D) Q1.6(D) Q1.7(D) Q1.8(D) ; port GREEN_SEL
H_LED_CTRL: R173.2 ; port H_LED_CTRL
PWM_CTRL_GREEN: R175.2 ; port PWM_CTRL_GREEN
PWM_CTRL_RED: R177.2 ; port PWM_CTRL_RED
PWM_GREEN: R40.2 R71.2 R176.1 U7.2(B0) U7.12(B2)
PWM_RED: R41.2 R77.2 R178.1 U7.5(B1) U7.9(B3)
RED_SEL: Q2.5(D) Q2.6(D) Q2.7(D) Q2.8(D) ; port RED_SEL
NetLED1_1: LED1.1(CG) R19.1
NetLED1_3: LED1.3(CR) R20.1
NetLED2_1: LED2.1(CG) R179.1
NetLED2_3: LED2.3(CR) R180.1
NetLED3_1: LED3.1(CG) R181.1
NetLED3_3: LED3.3(CR) R182.1
NetLED4_1: LED4.1(CG) R183.1
NetLED4_3: LED4.3(CR) R184.1
NetLED5_1: LED5.1(CG) R185.1
NetLED5_3: LED5.3(CR) R186.1
NetQ1_4: Q1.4(G) Q3.3(C) R38.1
NetQ2_4: Q2.4(G) Q4.3(C) R39.1
NetQ3_1: Q3.1(B) R40.1
NetQ4_1: Q4.1(B) R41.1
NetQ37_1: Q37.1(B) R46.2
NetQ37_3: Q37.3(C) R19.2
NetQ38_1: Q38.1(B) R47.1
NetQ38_3: Q38.3(C) R20.2
NetQ39_1: Q39.1(B) R53.2
NetQ39_3: Q39.3(C) R180.2 R182.2 R184.2 R186.2
NetQ40_1: Q40.1(B) R55.2
NetQ40_3: Q40.3(C) R179.2 R181.2 R183.2 R185.2
NetR42_1: R42.1 R172.2 U5.4(B)
NetR42_2: R42.2 R171.1 U5.3(A)
NetR43_1: R43.1 U5.5(DIR)
NetR45_2: R45.2 R172.1 U7.1(A0) U7.4(A1)
NetR46_1: R46.1 U7.3(O0)
NetR47_2: R47.2 U7.6(O1)
NetR48_1: R48.1 R174.2 U6.4(B)
NetR48_2: R48.2 R173.1 U6.3(A)
NetR49_1: R49.1 U6.5(DIR)
NetR51_2: R51.2 R174.1 U7.10(A3) U7.13(A2)
NetR53_1: R53.1 U7.8(O3)
NetR55_1: R55.1 U7.11(O2)
NetR67_1: R67.1 R176.2 U12.4(B)
NetR67_2: R67.2 R175.1 U12.3(A)
NetR69_1: R69.1 U12.5(DIR)
NetR74_1: R74.1 R178.2 U14.4(B)
NetR74_2: R74.2 R177.1 U14.3(A)
NetR75_1: R75.1 U14.5(DIR)

### Notes on the sheet
- /
- (in symbol 74ACT08SC) &
- (in symbol LED_484759_bicolor) G; R

### Library data of the parts
C12-C15 C25 C26 C29 C30 C64 = CMP-001-0374-4: as C10 on sheet Q_Light_CTRL1; ComponentLink3URL: https://www.digikey.com/en/products/detail/yageo/CC0402MRX5R5BB106/5195138; MPN: 04023C104KAT2A; ComponentLink1URL: https://www.yageo.com/upload/media/product/productsearch/datasheet/mlcc/UPY-GPHC_X5R_4V-to-50V_26.pdf; Package: 0402 (1005 Metric); Size: 1.00mm x 0.50mm; Height max: 700µm; Mounting Type: SM; Tolerance: 10%; ComponentLink1Description: Datasheet; ComponentLink3Description: Digikey; Ratings: -; Dielectric: X7R; ComponentLink2Description: Mouser; ComponentLink2URL: https://eu.mouser.com/ProductDetail/YAGEO/CC0402MRX5R5BB106?qs=zEY9bCHj09eCmUJdZuS5Lg%3D%3D; Lead Spacing: 0mm; Component Type: Ceramic Capacitor; Voltage Rating: 25V
LED1-LED5 = LED_484759_bicolor: Parameter 1: https://cdn.shopify.com/s/files/1/0695/1347/8453/files/484759.pdf; ComponentLink1Description: Datasheet; ComponentLink1URL: https://cdn.shopify.com/s/files/1/0695/1347/8453/files/484759.pdf
Q1 Q2 = SI4427BDY-T1-E3: MOSFET P-CH 30V 9.7A 8SO; MF: Vishay Siliconix; Drive Voltage (Max Rds On, Min Rds On): 2.5V, 10V; FET Type: P-Channel; Current - Continuous Drain (Id) @ 25°C: 9.7A (Ta); Vgs(th) (Max) @ Id: 1.4V @ 250µA; Gate Charge (Qg) (Max) @ Vgs: 70 nC @ 4.5 V; DigiKey: https://www.digikey.bg/en/products/detail/vishay-siliconix/SI4427BDY-T1-E3/1656428; MPN: SI4427BDY-T1-E3; Package: SOIC-8 Vishay Siliconix; Drain to Source Voltage (Vdss): 30V; ComponentLink1Description: Datasheet; ComponentLink1URL: https://www.vishay.com/docs/72295/si4427bd.pdf
Q3 Q4 Q37-Q40 = MMBT3904-TP: TRANS NPN 40V 0.2A SOT23; Mfr_Name: MCC; Current - Collector (Ic) (Max): 200 mA; MPN: MMBT3904-TP; Voltage - Collector Emitter Breakdown (Max): 40 V; Transistor Type: NPN
R19 R179 R181 R183 R185 = CMP-001-0628-7: RES 91 OHM 5% 1/10W 0603; Manufacturer: YAGEO; Power: 100mW; Temperature Coefficient: ±100ppm; Tolerance: 1%; Op Temp max: 155°C; Op Temp min: -55°C; PMNT: DNP; Ratings: -; ComponentLink3URL: https://www.digikey.com/en/products/detail/yageo/RC0603FR-0710KL/726880?s=N4IgTCBcDaIEoGEAMA2JBmAYnAtEg7AIxIDSAMiALoC%2BQA; Size: 1.60mm x 0.80mm; ComponentLink1Description: Datasheet; ComponentLink3Description: Digikey; ComponentLink2Description: Mouser; ComponentLink1URL: https://www.yageo.com/upload/media/product/products/datasheet/rchip/PYu-RC_51_RoHS_P_4.pdf; Composition: Thick Film; Package: 0603 (1608 Metric); ComponentLink2URL: https://eu.mouser.com/ProductDetail/YAGEO/RC0603FR-0710KL?qs=grNVn54RoB%252B3GtjbJj3wJQ%3D%3D; Mounting Type: SM; Height max: 550µm; MPN: RC0603JR-0791RL; Component Type: Chip Resistor
R20 R180 R182 R184 R186 = CMP-001-0628-7: RES 150 OHM 5% 1/10W 0603; Manufacturer: YAGEO; Power: 100mW; Temperature Coefficient: ±100ppm; Tolerance: 1%; Op Temp max: 155°C; Op Temp min: -55°C; Ratings: -; ComponentLink3URL: https://www.digikey.com/en/products/detail/yageo/RC0603FR-0710KL/726880?s=N4IgTCBcDaIEoGEAMA2JBmAYnAtEg7AIxIDSAMiALoC%2BQA; Size: 1.60mm x 0.80mm; ComponentLink1Description: Datasheet; ComponentLink3Description: Digikey; ComponentLink2Description: Mouser; ComponentLink1URL: https://www.yageo.com/upload/media/product/products/datasheet/rchip/PYu-RC_51_RoHS_P_4.pdf; Composition: Thick Film; Package: 0603 (1608 Metric); ComponentLink2URL: https://eu.mouser.com/ProductDetail/YAGEO/RC0603FR-0710KL?qs=grNVn54RoB%252B3GtjbJj3wJQ%3D%3D; Mounting Type: SM; Height max: 550µm; MPN: RC0603JR-07150RL; Component Type: Chip Resistor
R38 R39 = CMP-001-0628-7: RES 2.7K OHM 1% 1/10W 0603; Manufacturer: YAGEO; Power: 100mW; Temperature Coefficient: ±100ppm; Op Temp max: 155°C; Op Temp min: -55°C; Ratings: -; ComponentLink3URL: https://www.digikey.com/en/products/detail/yageo/RC0603FR-0710KL/726880?s=N4IgTCBcDaIEoGEAMA2JBmAYnAtEg7AIxIDSAMiALoC%2BQA; Size: 1.60mm x 0.80mm; ComponentLink1Description: Datasheet; ComponentLink3Description: Digikey; ComponentLink2Description: Mouser; ComponentLink1URL: https://www.yageo.com/upload/media/product/products/datasheet/rchip/PYu-RC_51_RoHS_P_4.pdf; Composition: Thick Film; Package: 0603 (1608 Metric); ComponentLink2URL: https://eu.mouser.com/ProductDetail/YAGEO/RC0603FR-0710KL?qs=grNVn54RoB%252B3GtjbJj3wJQ%3D%3D; Mounting Type: SM; Tolerance: 1%; Height max: 550µm; MPN: RC0603FR-072K7L; Component Type: Chip Resistor
R40 R41 = CMP-001-0628-7: RES 4.7K OHM 1% 1/10W 0603; Manufacturer: YAGEO; Power: 100mW; Temperature Coefficient: ±100ppm; Op Temp max: 155°C; Op Temp min: -55°C; PMNT: DNP; Ratings: -; Size: 1.60mm x 0.80mm; ComponentLink1Description: Datasheet; ComponentLink3Description: Digikey; ComponentLink2Description: Mouser; ComponentLink1URL: https://www.yageo.com/upload/media/product/products/datasheet/rchip/PYu-RC_51_RoHS_P_4.pdf; Composition: Thick Film; Package: 0603 (1608 Metric); ComponentLink2URL: https://eu.mouser.com/ProductDetail/YAGEO/RC0603FR-0710KL?qs=grNVn54RoB%252B3GtjbJj3wJQ%3D%3D; Mounting Type: SM; Tolerance: 1%; Height max: 550µm; MPN: RC0603FR-074K7L; Component Type: Chip Resistor
  R40: ComponentLink3URL: https://www.digikey.pl/en/products/detail/yageo/rc0603fr-074k7l/727212
  R41: ComponentLink3URL: https://www.digikey.com/en/products/detail/yageo/RC0603FR-0710KL/726880?s=N4IgTCBcDaIEoGEAMA2JBmAYnAtEg7AIxIDSAMiALoC%2BQA
R42 R48 R67 R74 = CMP-001-0628-7: RES 0 OHM JUMPER 1/10W 0603; Manufacturer: YAGEO; MPN: RC0603FR-0710KL; Power: 100mW; Temperature Coefficient: ±100ppm; Tolerance: 1%; Op Temp max: 155°C; Op Temp min: -55°C; Ratings: -; ComponentLink3URL: https://www.digikey.com/en/products/detail/yageo/RC0603FR-0710KL/726880?s=N4IgTCBcDaIEoGEAMA2JBmAYnAtEg7AIxIDSAMiALoC%2BQA; Size: 1.60mm x 0.80mm; ComponentLink1Description: Datasheet; ComponentLink3Description: Digikey; ComponentLink2Description: Mouser; ComponentLink1URL: https://www.yageo.com/upload/media/product/products/datasheet/rchip/PYu-RC_51_RoHS_P_4.pdf; Composition: Thick Film; Package: 0603 (1608 Metric); ComponentLink2URL: https://eu.mouser.com/ProductDetail/YAGEO/RC0603FR-0710KL?qs=grNVn54RoB%252B3GtjbJj3wJQ%3D%3D; Mounting Type: SM; Height max: 550µm; Component Type: Chip Resistor; PMNT: DNP; DNP: DNP
  R42 R48 R74: Resistance: DNP
R43 R49 R69 R75 = CMP-001-0628-7: RES 0 OHM JUMPER 1/10W 0603; Manufacturer: YAGEO; MPN: RC0603FR-0710KL; Power: 100mW; Temperature Coefficient: ±100ppm; Tolerance: 1%; Op Temp max: 155°C; Op Temp min: -55°C; PMNT: DNP; Ratings: -; ComponentLink3URL: https://www.digikey.com/en/products/detail/yageo/RC0603FR-0710KL/726880?s=N4IgTCBcDaIEoGEAMA2JBmAYnAtEg7AIxIDSAMiALoC%2BQA; Size: 1.60mm x 0.80mm; ComponentLink1Description: Datasheet; ComponentLink3Description: Digikey; ComponentLink2Description: Mouser; ComponentLink1URL: https://www.yageo.com/upload/media/product/products/datasheet/rchip/PYu-RC_51_RoHS_P_4.pdf; Composition: Thick Film; Package: 0603 (1608 Metric); ComponentLink2URL: https://eu.mouser.com/ProductDetail/YAGEO/RC0603FR-0710KL?qs=grNVn54RoB%252B3GtjbJj3wJQ%3D%3D; Mounting Type: SM; Height max: 550µm; Component Type: Chip Resistor
R45 R51 R71 R77 = CMP-001-0628-7: RES SMD 5.6K OHM 5% 1/10W 0603; Manufacturer: YAGEO; MPN: DNP; Power: 100mW; Temperature Coefficient: ±100ppm; Tolerance: 1%; Op Temp max: 155°C; Op Temp min: -55°C; Ratings: -; ComponentLink3URL: https://www.digikey.com/en/products/detail/yageo/RC0603FR-0710KL/726880?s=N4IgTCBcDaIEoGEAMA2JBmAYnAtEg7AIxIDSAMiALoC%2BQA; Size: 1.60mm x 0.80mm; ComponentLink1Description: Datasheet; ComponentLink3Description: Digikey; ComponentLink2Description: Mouser; ComponentLink1URL: https://www.yageo.com/upload/media/product/products/datasheet/rchip/PYu-RC_51_RoHS_P_4.pdf; Composition: Thick Film; Package: 0603 (1608 Metric); ComponentLink2URL: https://eu.mouser.com/ProductDetail/YAGEO/RC0603FR-0710KL?qs=grNVn54RoB%252B3GtjbJj3wJQ%3D%3D; Mounting Type: SM; Height max: 550µm; Component Type: Chip Resistor
R46 R47 R53 R55 = CMP-001-0628-7: RES 2.2K OHM 1% 1/10W 0603; Manufacturer: YAGEO; Power: 100mW; Temperature Coefficient: ±100ppm; Op Temp max: 155°C; Op Temp min: -55°C; PMNT: DNP; Ratings: -; Size: 1.60mm x 0.80mm; ComponentLink1Description: Datasheet; ComponentLink3Description: Digikey; ComponentLink2Description: Mouser; ComponentLink1URL: https://www.yageo.com/upload/media/product/products/datasheet/rchip/PYu-RC_51_RoHS_P_4.pdf; Composition: Thick Film; Package: 0603 (1608 Metric); ComponentLink2URL: https://eu.mouser.com/ProductDetail/YAGEO/RC0603FR-0710KL?qs=grNVn54RoB%252B3GtjbJj3wJQ%3D%3D; Mounting Type: SM; Tolerance: 1%; Height max: 550µm; MPN: RC0603FR-072K2L; Component Type: Chip Resistor
  R46 R47: ComponentLink3URL: https://www.digikey.com/en/products/detail/yageo/RC0603FR-0710KL/726880?s=N4IgTCBcDaIEoGEAMA2JBmAYnAtEg7AIxIDSAMiALoC%2BQA
  R53 R55: ComponentLink3URL: https://www.digikey.pl/en/products/detail/yageo/rc0603fr-072k2l/727016
R171-R178 = CMP-001-0484-6: as R130 on sheet Q_Light_CTRL1; ComponentLink3URL: https://www.digikey.com/en/products/detail/yageo/RC0402FR-0727RL/5280946; ComponentLink2Description: Mouser; Ratings: -; Tolerance: 1%; Height max: 400µm; MPN: RC0402FR-0733RL; ComponentLink1URL: https://www.yageo.com/upload/media/product/productsearch/datasheet/rchip/PYu-RC_Group_51_RoHS_L_12.pdf; Size: 1.00mm x 0.50mm; Composition: Thick Film; Package: 0402 (1005 Metric); ComponentLink3Description: Digikey; Mounting Type: SM; ComponentLink2URL: https://eu.mouser.com/ProductDetail/YAGEO/RC0402FR-0727RL?qs=UOUeRUa%252B8Wlb37UyFHw9Bw%3D%3D; ComponentLink1Description: Datasheet; Component Type: Chip Resistor
U5 U6 U12 U14 = 74LVCH1T45GM,132: IC TRANSLTR BIDIRECTIONAL 6XSON; Mfr_Name: Nexperia; Voltage min: 1.2 V; Moltage max: 5.5 V; MPN: 74LVCH1T45GM,132
U7 = 74ACT08SC: IC GATE AND 4CH 2-INP 14SOIC; Voltage: 4.5V - 5.5V; MF: onsemi; Value: *; MPN: 74ACT08SC; Package: SOIC-14 ON